# EAGLE schematic 6502_nes_book (EAGLE 6.4), part 4 of 5
## Sheet 20 of 29
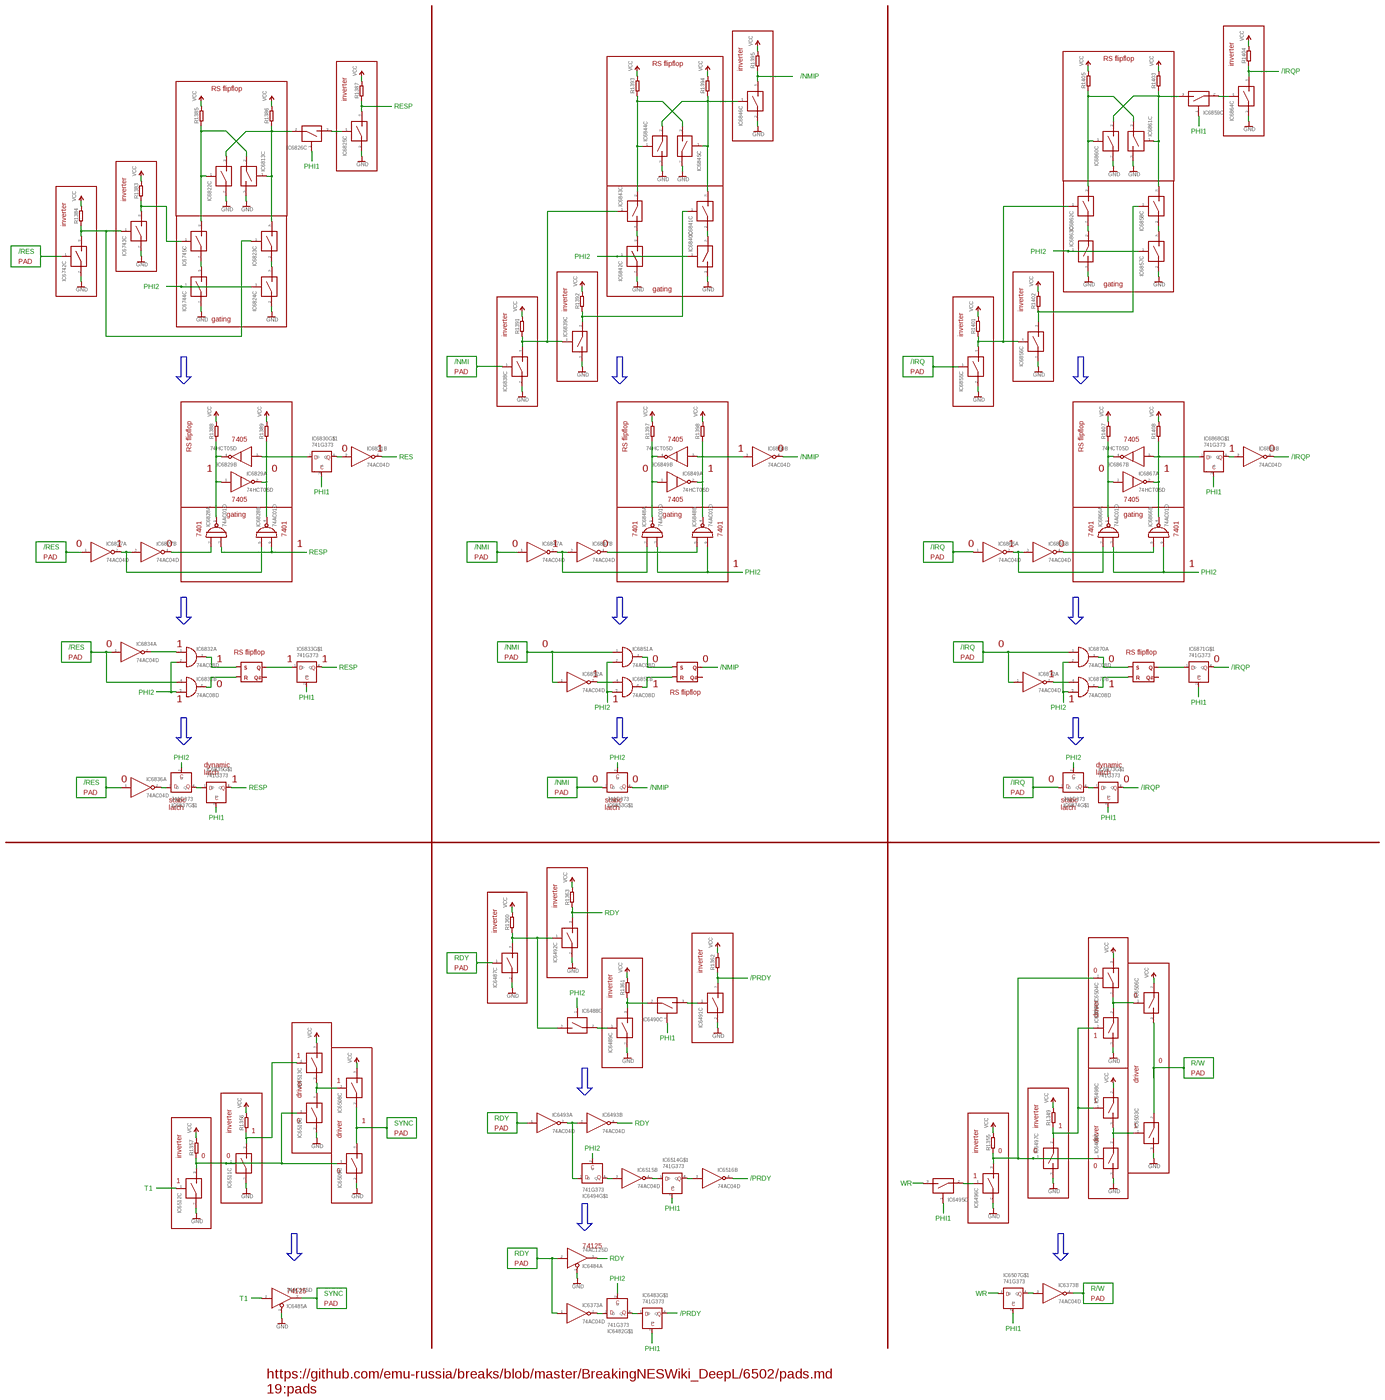
[diagram p24: schematic, sheet 20, overview]
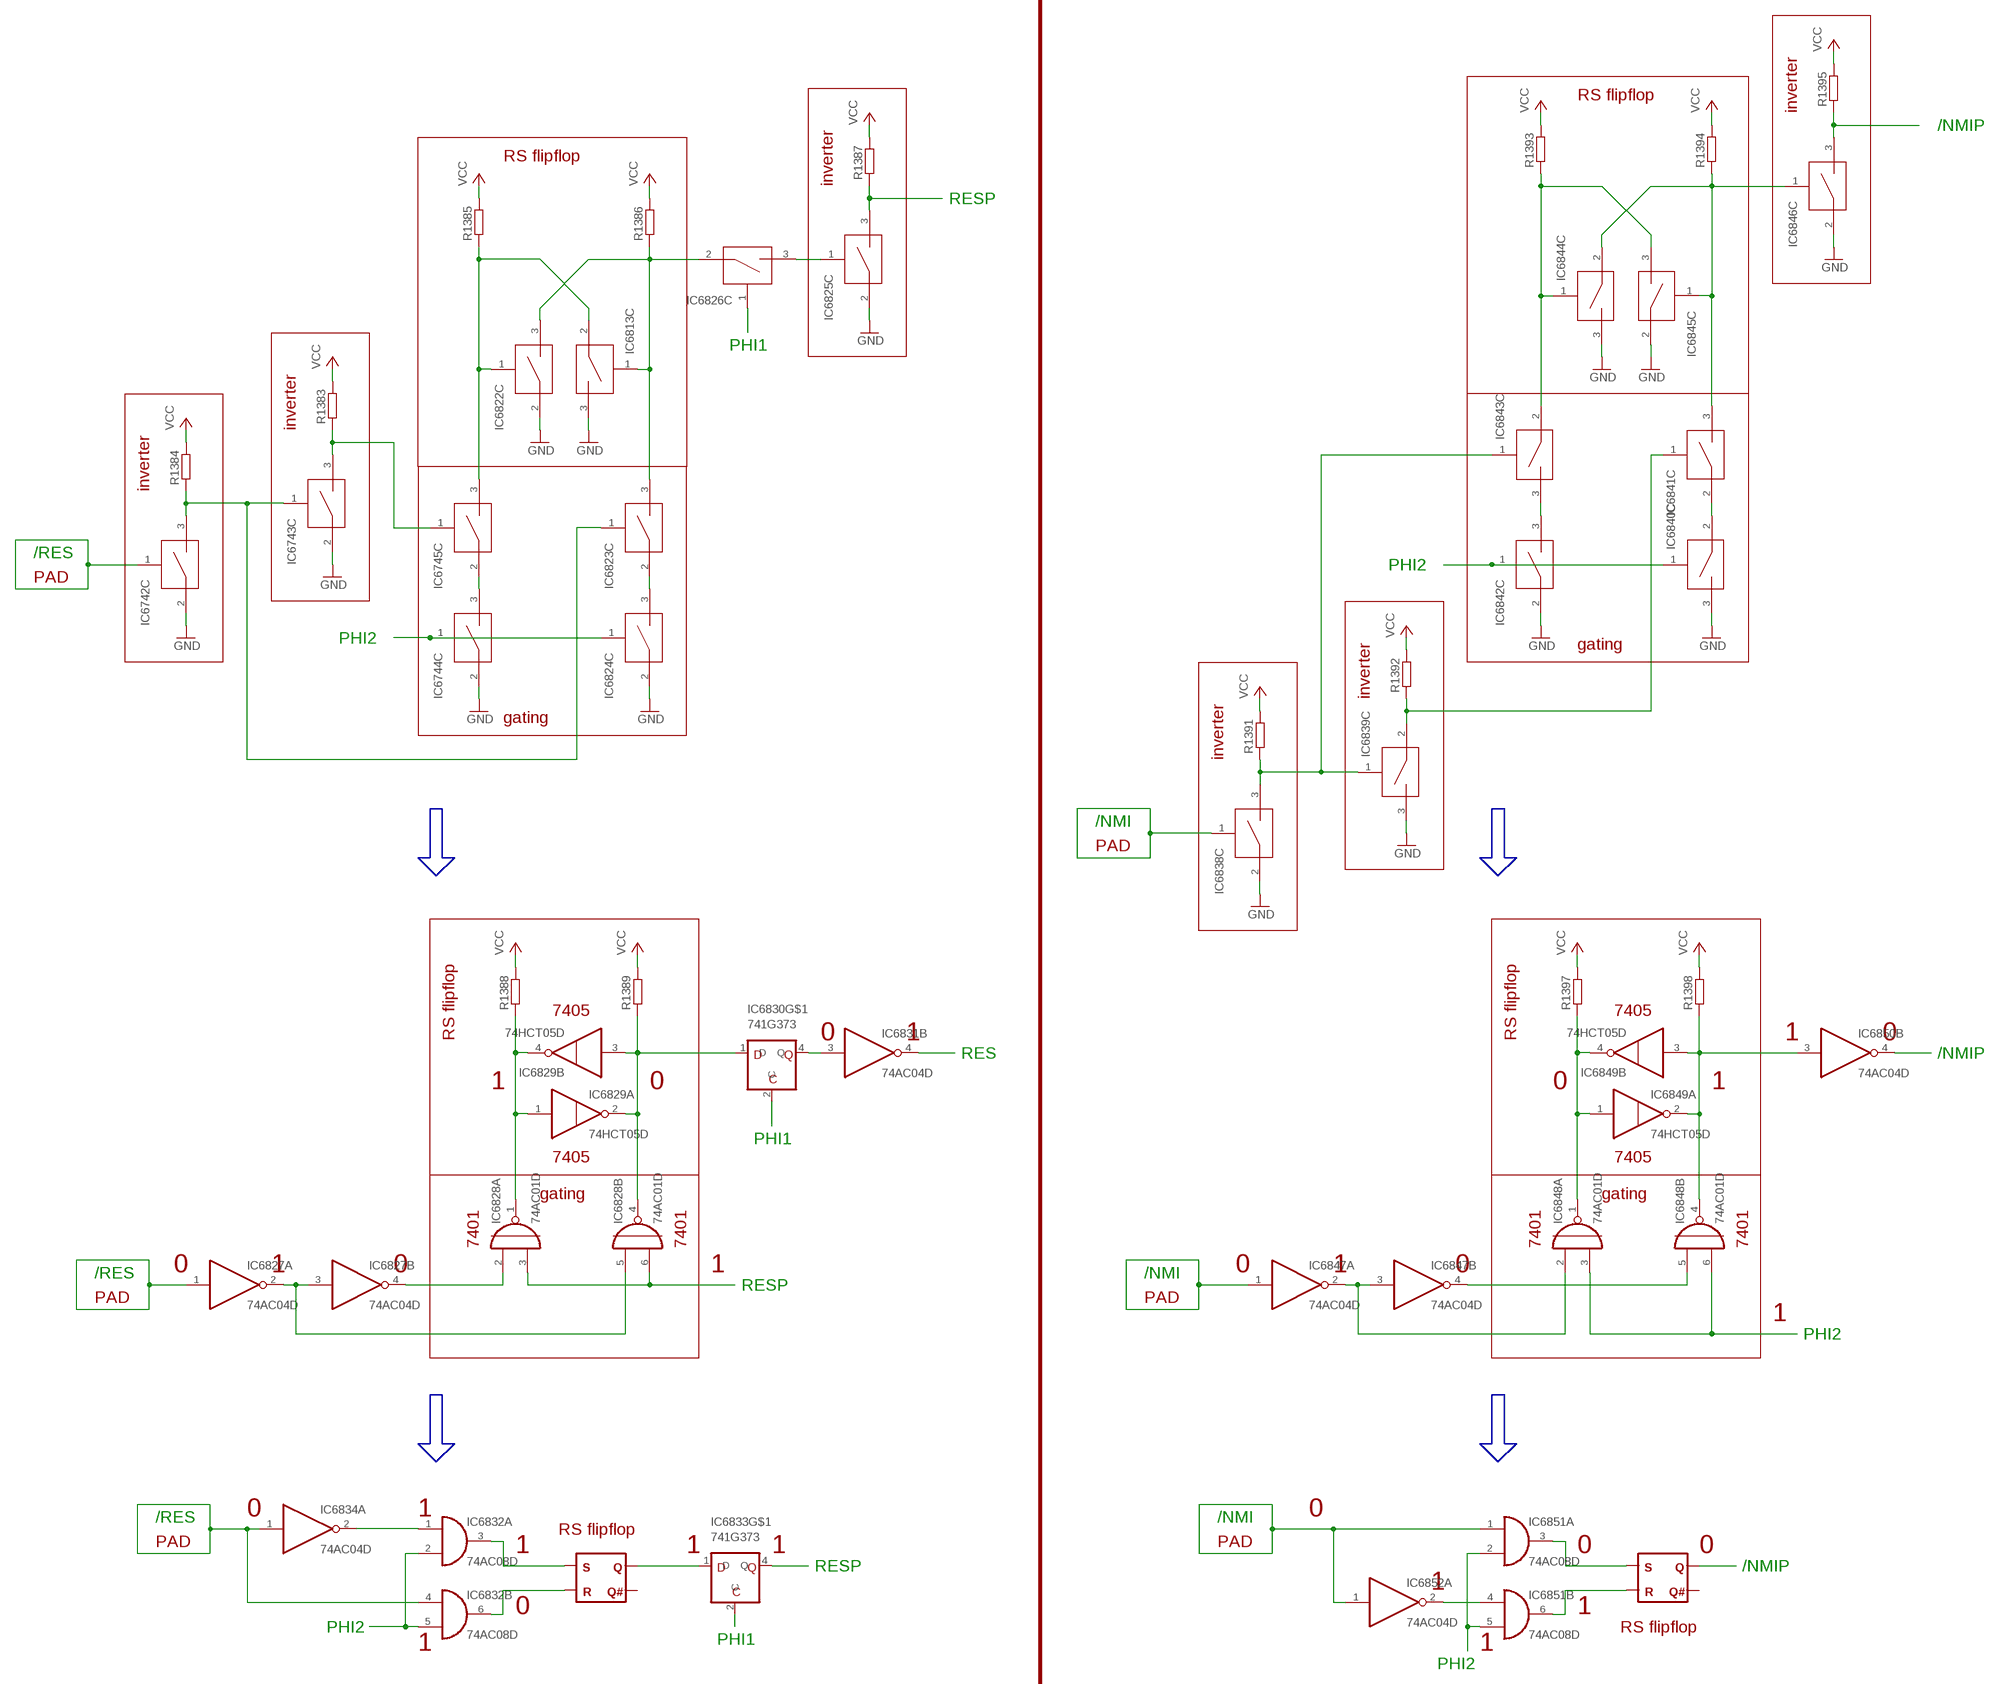
[diagram p25: schematic, sheet 20, part 1 of 4]
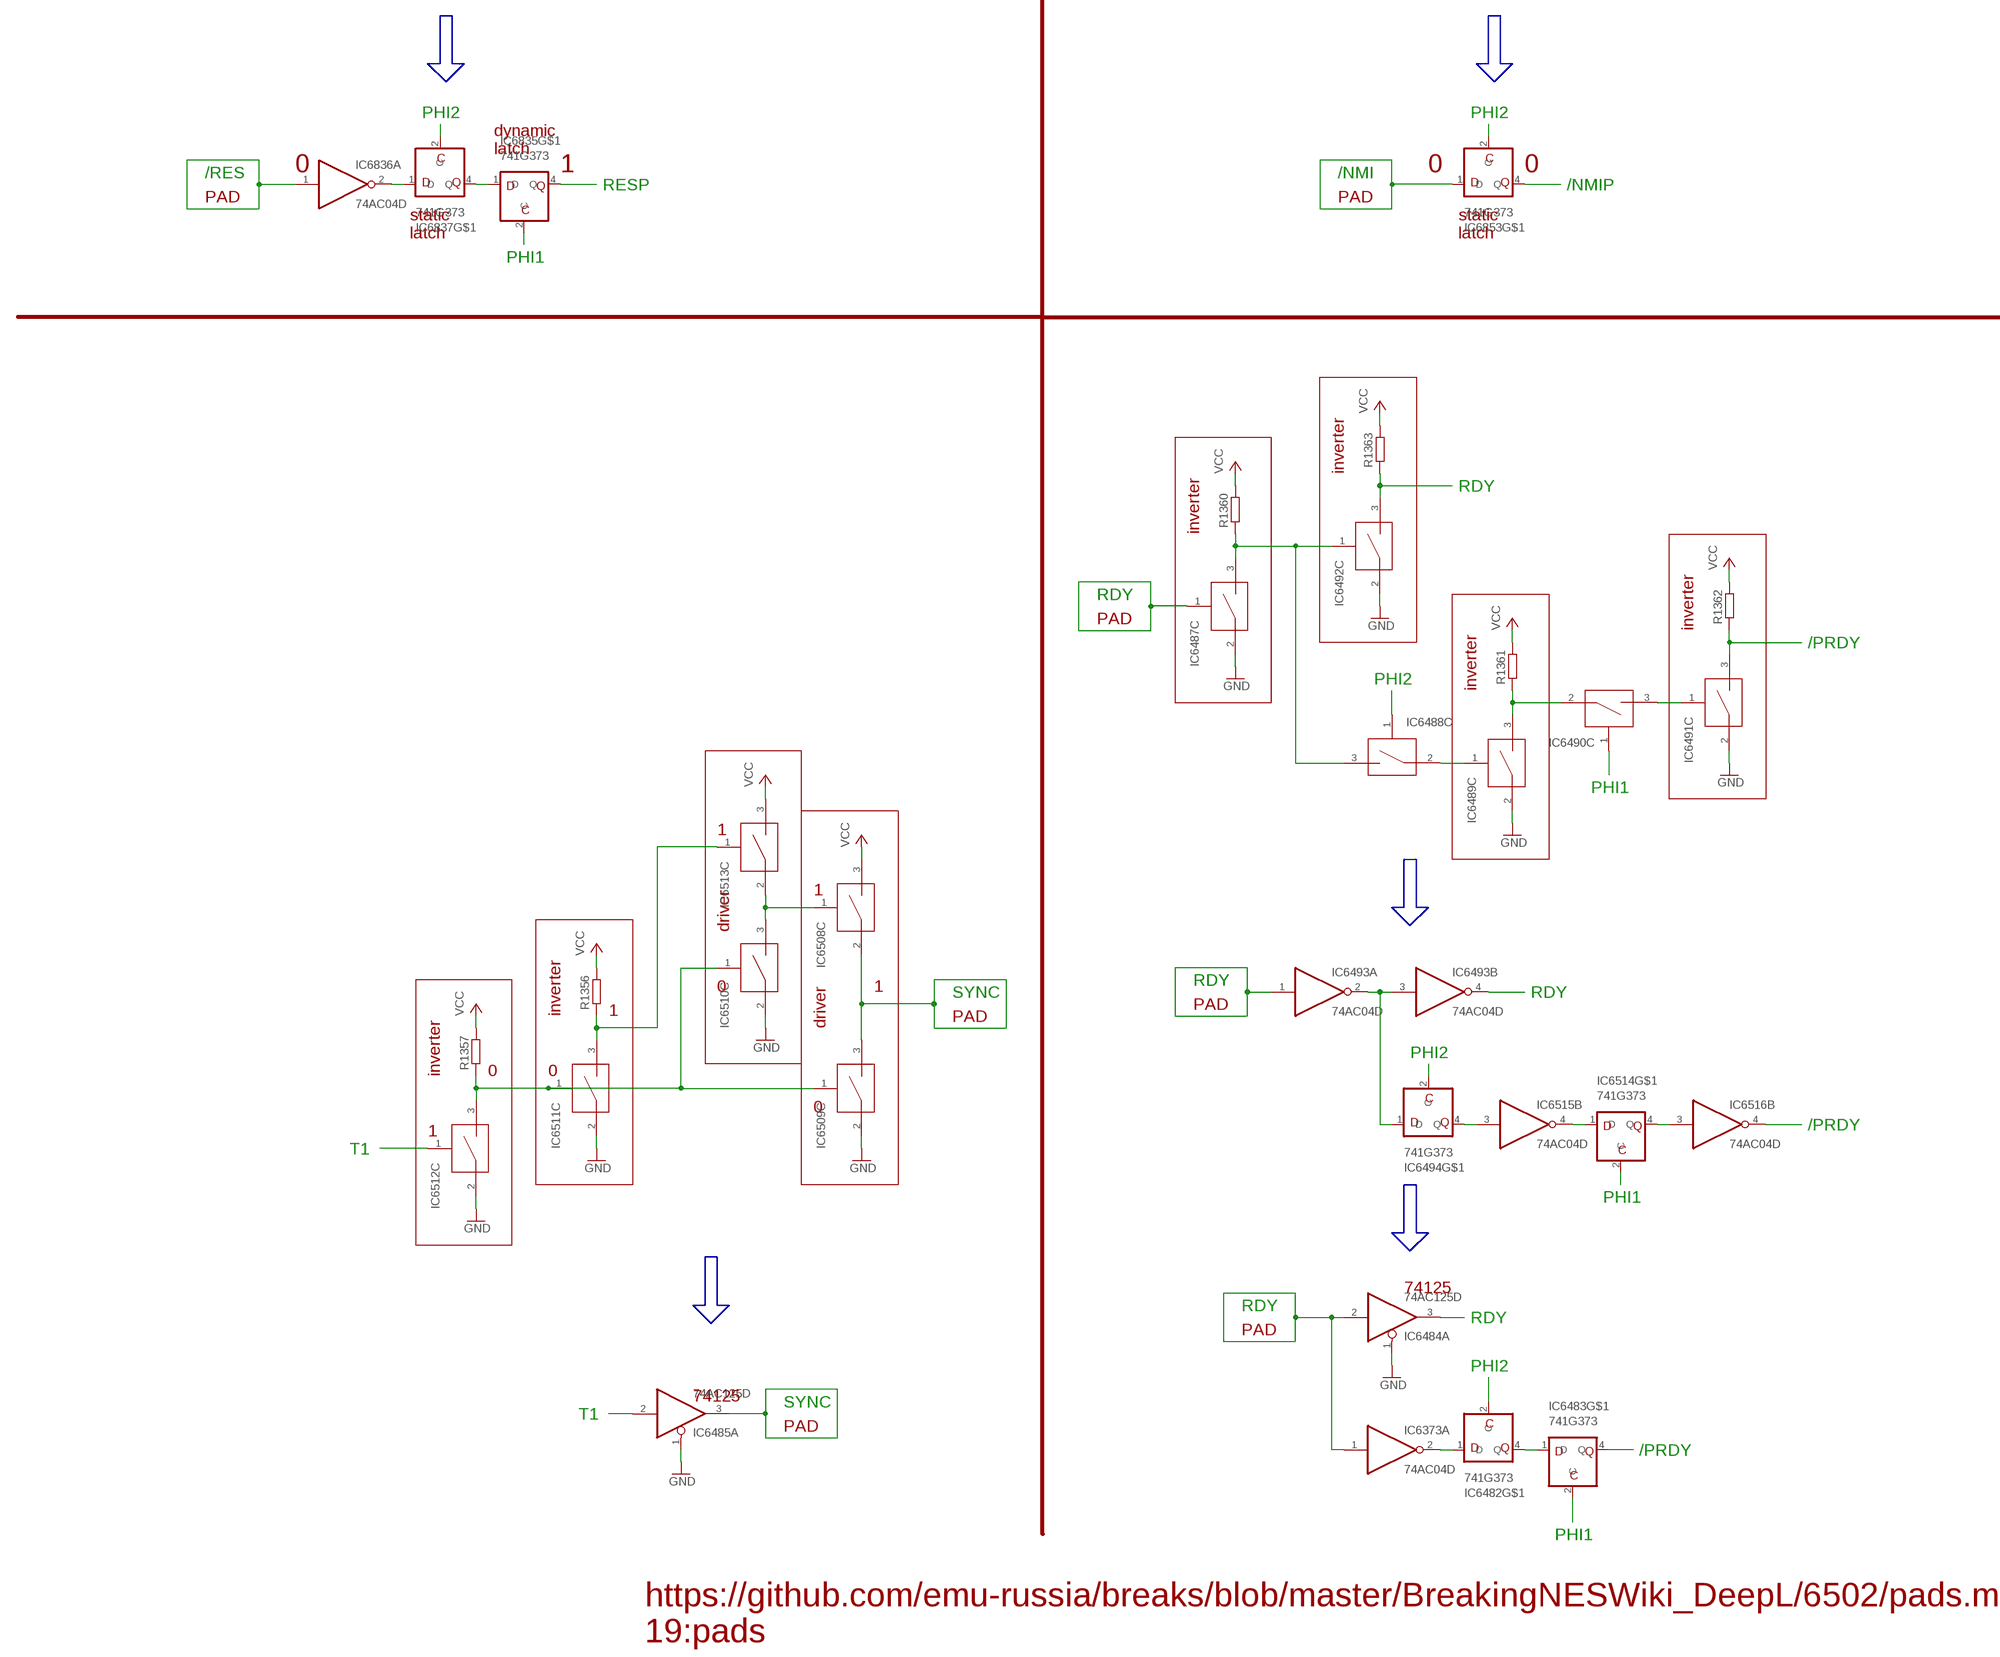
[diagram p26: schematic, sheet 20, part 2 of 4]
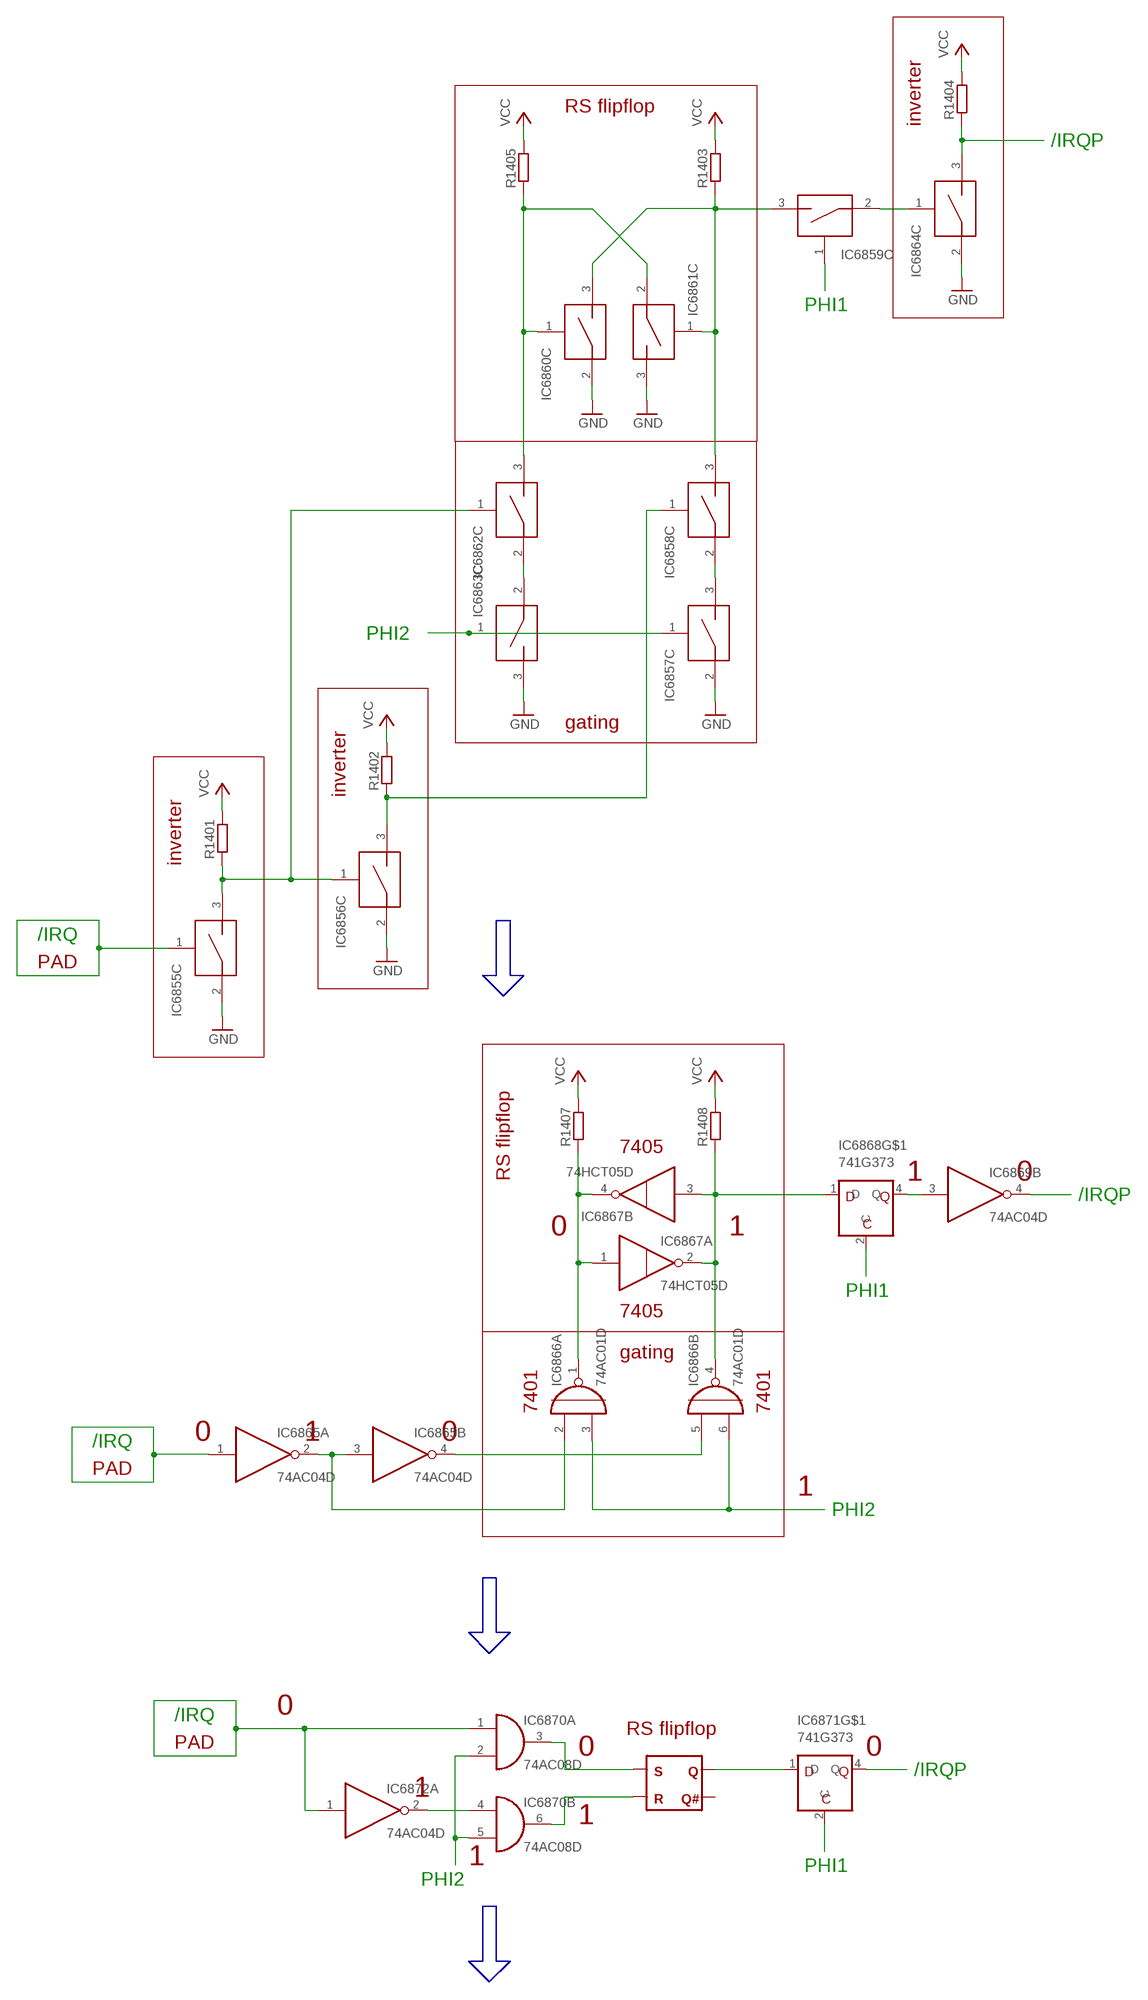
[diagram p27: schematic, sheet 20, part 3 of 4]
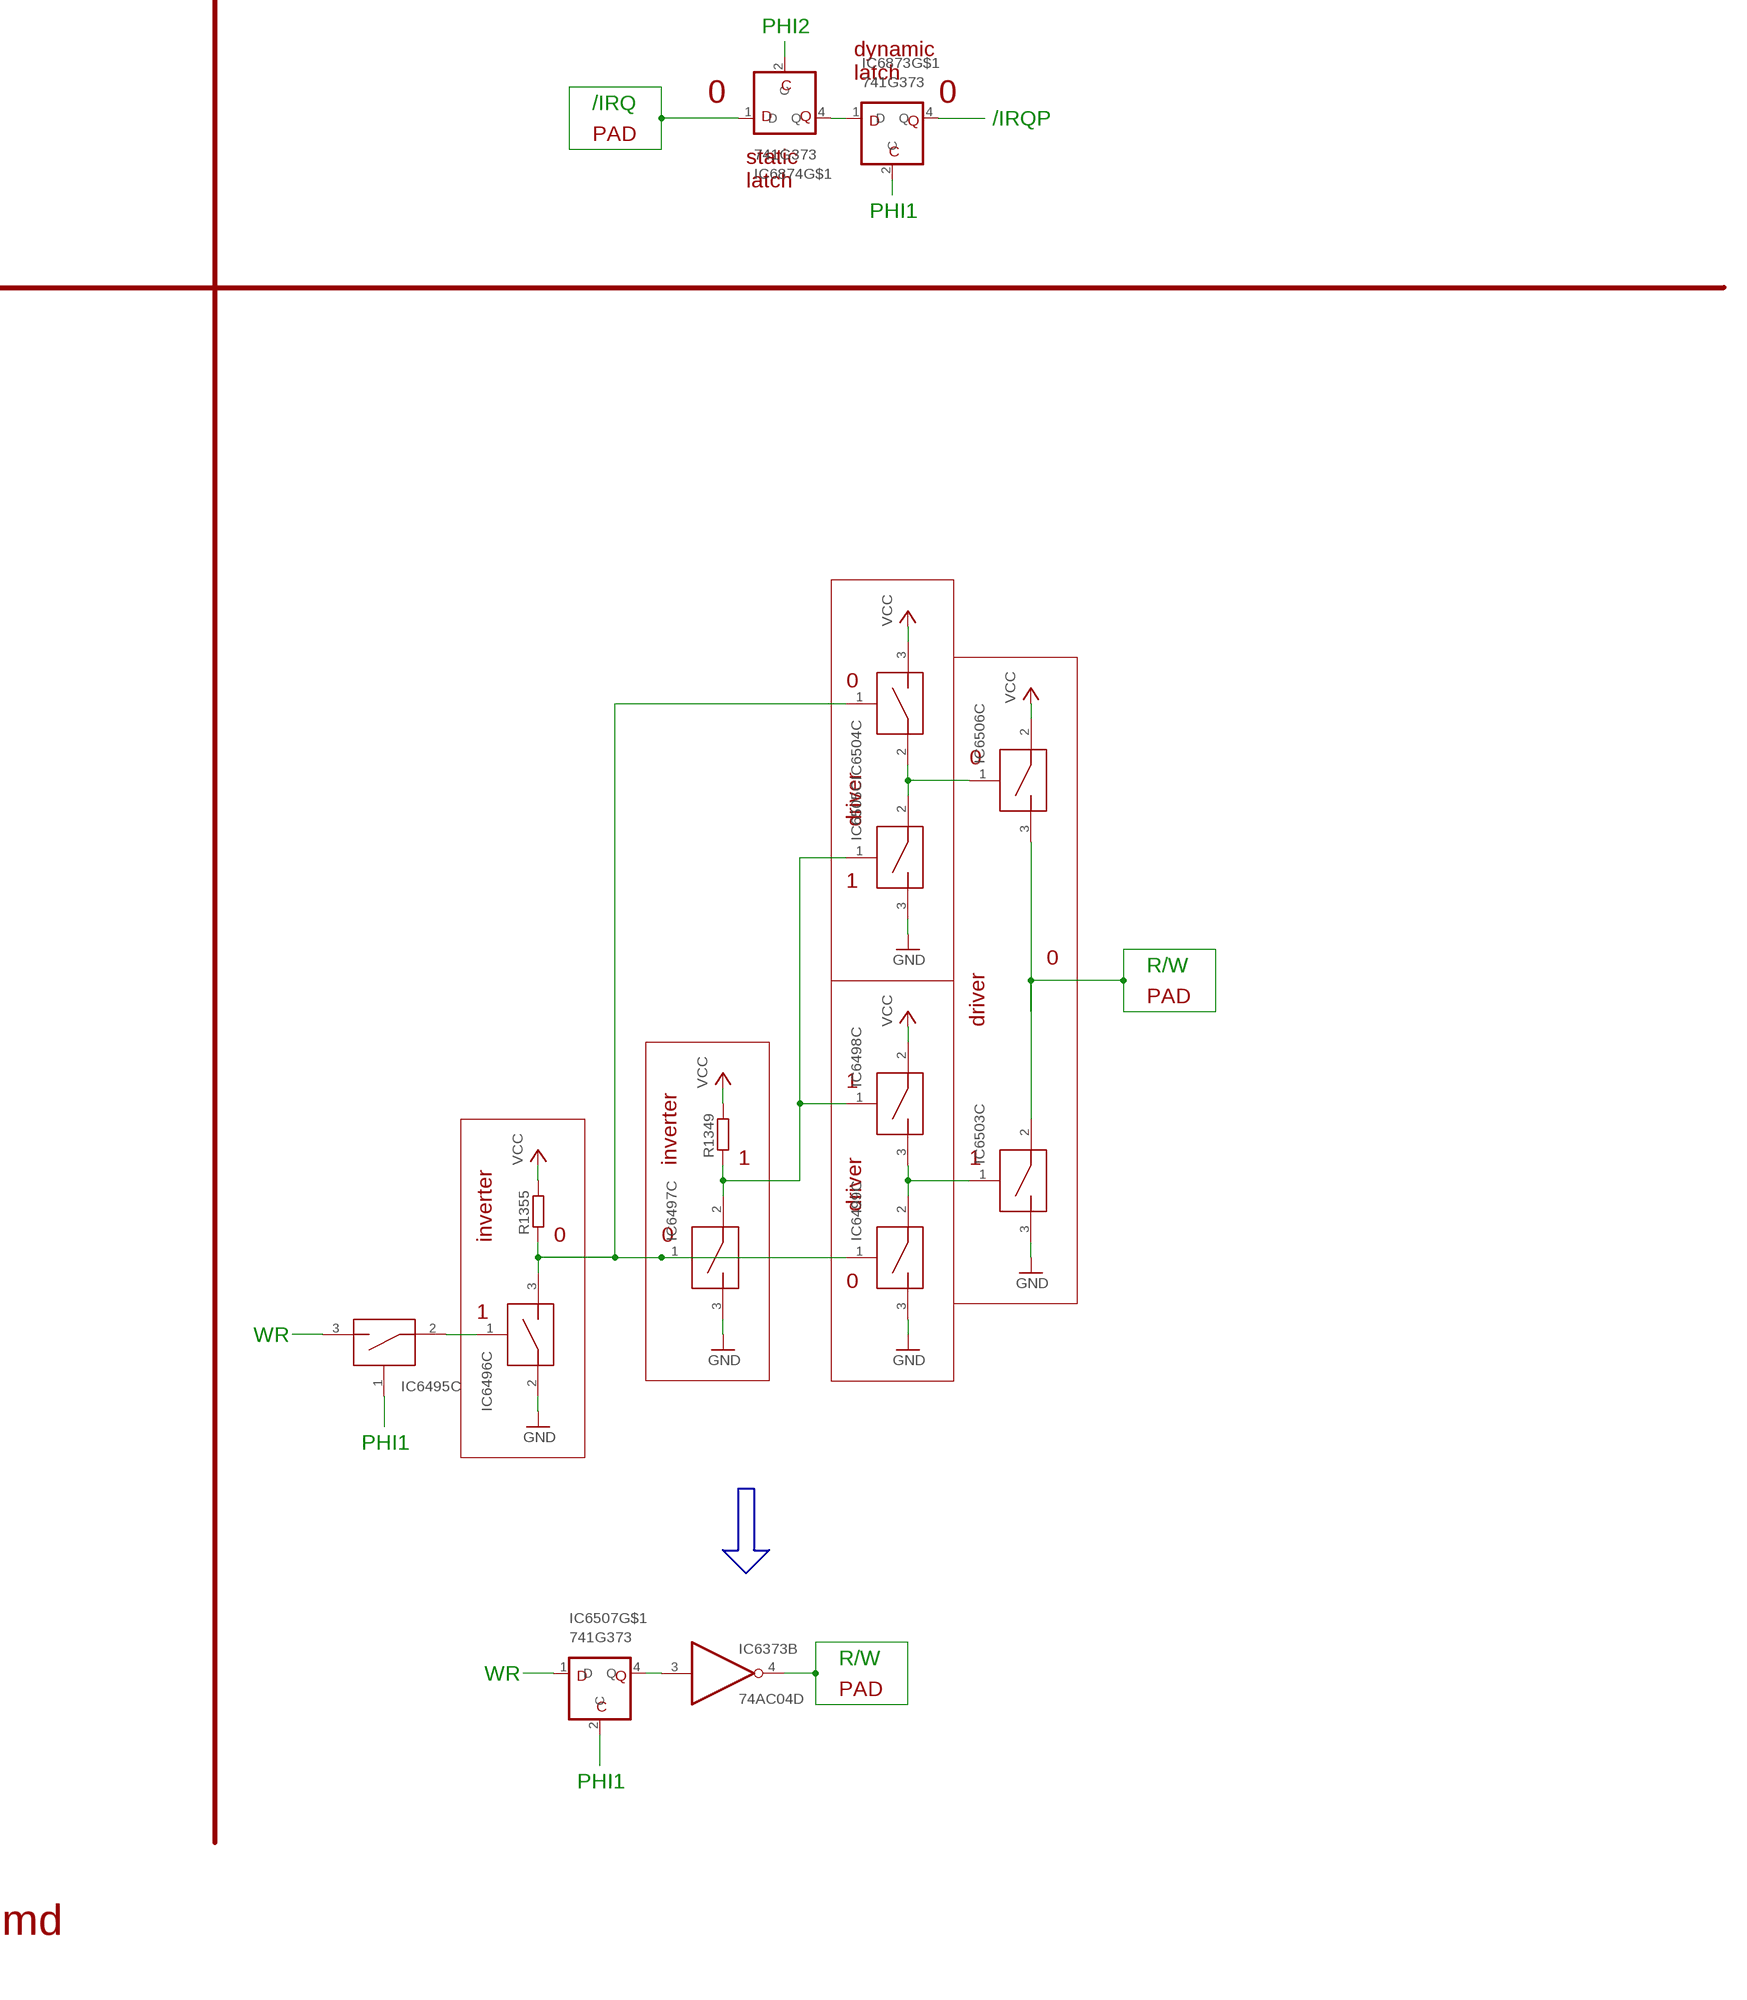
[diagram p28: schematic, sheet 20, part 4 of 4]

### Parts
IC6373  74AC04D  [SO14]
IC6482  741G373  [DBV-R-PDSO-G5]
IC6483  741G373  [DBV-R-PDSO-G5]
IC6484  74AC125D  [SO14]
IC6485  74AC125D  [SO14]
IC6487  MAX4613SO16  [SO16]
IC6488  MAX4613SO16  [SO16]
IC6489  MAX4613SO16  [SO16]
IC6490  MAX4613SO16  [SO16]
IC6491  MAX4613SO16  [SO16]
IC6492  MAX4613SO16  [SO16]
IC6493  74AC04D  [SO14]
IC6494  741G373  [DBV-R-PDSO-G5]
IC6495  MAX4613SO16  [SO16]
IC6496  MAX4613SO16  [SO16]
IC6497  MAX4613SO16  [SO16]
IC6498  MAX4613SO16  [SO16]
IC6499  MAX4613SO16  [SO16]
IC6503  MAX4613SO16  [SO16]
IC6504  MAX4613SO16  [SO16]
IC6505  MAX4613SO16  [SO16]
IC6506  MAX4613SO16  [SO16]
IC6507  741G373  [DBV-R-PDSO-G5]
IC6508  MAX4613SO16  [SO16]
IC6509  MAX4613SO16  [SO16]
IC6510  MAX4613SO16  [SO16]
IC6511  MAX4613SO16  [SO16]
IC6512  MAX4613SO16  [SO16]
IC6513  MAX4613SO16  [SO16]
IC6514  741G373  [DBV-R-PDSO-G5]
IC6515  74AC04D  [SO14]
IC6516  74AC04D  [SO14]
IC6742  MAX4613SO16  [SO16]
IC6743  MAX4613SO16  [SO16]
IC6744  MAX4613SO16  [SO16]
IC6745  MAX4613SO16  [SO16]
IC6813  MAX4613SO16  [SO16]
IC6822  MAX4613SO16  [SO16]
IC6823  MAX4613SO16  [SO16]
IC6824  MAX4613SO16  [SO16]
IC6825  MAX4613SO16  [SO16]
IC6826  MAX4613SO16  [SO16]
IC6827  74AC04D  [SO14]
IC6828  74AC01D  [SO14]
IC6829  74HCT05D  [SO14]
IC6830  741G373  [DBV-R-PDSO-G5]
IC6831  74AC04D  [SO14]
IC6832  74AC08D  [SO14]
IC6833  741G373  [DBV-R-PDSO-G5]
IC6834  74AC04D  [SO14]
IC6835  741G373  [DBV-R-PDSO-G5]
IC6836  74AC04D  [SO14]
IC6837  741G373  [DBV-R-PDSO-G5]
IC6838  MAX4613SO16  [SO16]
IC6839  MAX4613SO16  [SO16]
IC6840  MAX4613SO16  [SO16]
IC6841  MAX4613SO16  [SO16]
IC6842  MAX4613SO16  [SO16]
IC6843  MAX4613SO16  [SO16]
IC6844  MAX4613SO16  [SO16]
IC6845  MAX4613SO16  [SO16]
IC6846  MAX4613SO16  [SO16]
IC6847  74AC04D  [SO14]
IC6848  74AC01D  [SO14]
IC6849  74HCT05D  [SO14]
IC6850  74AC04D  [SO14]
IC6851  74AC08D  [SO14]
IC6852  74AC04D  [SO14]
IC6853  741G373  [DBV-R-PDSO-G5]
IC6855  MAX4613SO16  [SO16]
IC6856  MAX4613SO16  [SO16]
IC6857  MAX4613SO16  [SO16]
IC6858  MAX4613SO16  [SO16]
IC6859  MAX4613SO16  [SO16]
IC6860  MAX4613SO16  [SO16]
IC6861  MAX4613SO16  [SO16]
IC6862  MAX4613SO16  [SO16]
IC6863  MAX4613SO16  [SO16]
IC6864  MAX4613SO16  [SO16]
IC6865  74AC04D  [SO14]
IC6866  74AC01D  [SO14]
IC6867  74HCT05D  [SO14]
IC6868  741G373  [DBV-R-PDSO-G5]
IC6869  74AC04D  [SO14]
IC6870  74AC08D  [SO14]
IC6871  741G373  [DBV-R-PDSO-G5]
IC6872  74AC04D  [SO14]
IC6873  741G373  [DBV-R-PDSO-G5]
IC6874  741G373  [DBV-R-PDSO-G5]
R1349  R-EU_R0603  [R0603]
R1355  R-EU_R0603  [R0603]
R1356  R-EU_R0603  [R0603]
R1357  R-EU_R0603  [R0603]
R1360  R-EU_R0603  [R0603]
R1361  R-EU_R0603  [R0603]
R1362  R-EU_R0603  [R0603]
R1363  R-EU_R0603  [R0603]
R1383  R-EU_R0603  [R0603]
R1384  R-EU_R0603  [R0603]
R1385  R-EU_R0603  [R0603]
R1386  R-EU_R0603  [R0603]
R1387  R-EU_R0603  [R0603]
R1388  R-EU_R0603  [R0603]
R1389  R-EU_R0603  [R0603]
R1391  R-EU_R0603  [R0603]
R1392  R-EU_R0603  [R0603]
R1393  R-EU_R0603  [R0603]
R1394  R-EU_R0603  [R0603]
R1395  R-EU_R0603  [R0603]
R1397  R-EU_R0603  [R0603]
R1398  R-EU_R0603  [R0603]
R1401  R-EU_R0603  [R0603]
R1402  R-EU_R0603  [R0603]
R1403  R-EU_R0603  [R0603]
R1404  R-EU_R0603  [R0603]
R1405  R-EU_R0603  [R0603]
R1407  R-EU_R0603  [R0603]
R1408  R-EU_R0603  [R0603]

### Nets
GND: IC6484.1(A:OE) IC6485.1(A:OE) IC6487.2 IC6489.2 IC6491.2 IC6492.2 IC6496.2 IC6497.3 IC6499.3 IC6503.3 IC6505.3 IC6509.2 IC6510.2 IC6511.2 IC6512.2 IC6742.2 IC6743.2 IC6744.2 IC6813.3 IC6822.2 IC6824.2 IC6825.2 IC6838.2 IC6839.3 IC6840.3 IC6842.2 IC6844.3 IC6845.2 IC6846.2 IC6855.2 IC6856.2 IC6857.2 IC6860.2 IC6861.3 IC6863.3 IC6864.2 ; also sheet 1,2,3,4,9,10,11,12,13,14,19,21,22,23
N$11620: IC6484.3(A:O)
N$11621: IC6373.1(A:I) IC6484.2(A:I)
N$11622: IC6482.2(C)
N$11623: IC6483.2(C)
N$11624: IC6373.2(A:O) IC6482.1(D)
N$11625: IC6482.4(Q) IC6483.1(D)
N$11626: IC6483.4(Q)
N$11627: IC6485.3(A:O)
N$11628: IC6485.2(A:I)
N$11707: IC6487.1
N$11710: IC6487.3 IC6488.3 IC6492.1 R1360.1
N$11754: IC6488.1
N$11755: IC6488.2 IC6489.1
N$11756: IC6489.3 IC6490.2 R1361.1
N$11757: IC6507.2(C)
N$11758: IC6497.2 IC6498.1 IC6505.1 R1349.1
N$11759: IC6495.3
N$11760: IC6495.1
N$11761: IC6496.3 IC6497.1 IC6499.1 IC6504.1 R1355.1
N$11763: IC6495.2 IC6496.1
N$11764: IC6504.2 IC6505.2 IC6506.1
N$11765: IC6503.2 IC6506.3
N$11766: IC6498.3 IC6499.2 IC6503.1
N$11767: IC6507.1(D)
N$11769: IC6373.3(B:I) IC6507.4(Q)
N$11770: IC6490.1
N$11771: IC6373.4(B:O)
N$11772: IC6508.2 IC6509.3
N$11773: IC6491.3 R1362.1
N$11774: IC6511.3 IC6513.1 R1356.1
N$11775: IC6509.1 IC6510.1 IC6511.1 IC6512.3 R1357.1
N$11776: IC6512.1
N$11777: IC6508.1 IC6510.3 IC6513.2
N$11778: IC6492.3 R1363.1
N$11779: IC6490.3 IC6491.1
N$11780: IC6493.1(A:I)
N$11781: IC6493.4(B:O)
N$11782: IC6494.2(C)
N$11783: IC6514.2(C)
N$11784: IC6493.2(A:O) IC6493.3(B:I) IC6494.1(D)
N$11786: IC6494.4(Q) IC6515.3(B:I)
N$11787: IC6514.1(D) IC6515.4(B:O)
N$11788: IC6514.4(Q) IC6516.3(B:I)
N$11938: IC6516.4(B:O)
N$12262: IC6744.1 IC6824.1
N$12263: IC6742.1
N$12264: IC6826.1
N$12265: IC6838.1
N$12266: IC6742.3 IC6743.1 IC6823.1 R1384.1
N$12267: IC6743.3 IC6745.1 R1383.1
N$12268: IC6813.1 IC6822.3 IC6823.3 IC6826.2 R1386.1
N$12269: IC6745.3 IC6813.2 IC6822.1 R1385.1
N$12270: IC6825.3 R1387.1
N$12271: IC6744.3 IC6745.2
N$12443: IC6823.2 IC6824.3
N$12445: IC6840.1 IC6842.1
N$12448: IC6825.1 IC6826.3
N$12503: IC6827.1(A:I)
N$12506: IC6827.2(A:O) IC6827.3(B:I) IC6828.5(B:I0)
N$12507: IC6827.4(B:O) IC6828.2(A:I0)
N$12508: IC6828.3(A:I1) IC6828.6(B:I1)
N$12509: IC6828.1(A:O) IC6829.1(A:I) IC6829.4(B:O) R1388.1
N$12510: IC6828.4(B:O) IC6829.2(A:O) IC6829.3(B:I) IC6830.1(D) R1389.1
N$12511: IC6830.2(C)
N$12512: IC6830.4(Q) IC6831.3(B:I)
N$12513: IC6831.4(B:O)
N$12514: IC6833.2(C)
N$12515: IC6833.4(Q)
N$12516: IC6833.1(D)
N$12538: IC6832.3(A:O)
N$12540: IC6832.6(B:O)
N$12541: IC6832.4(B:I0) IC6834.1(A:I)
N$12542: IC6832.2(A:I1) IC6832.5(B:I1)
N$12543: IC6832.1(A:I0) IC6834.2(A:O)
N$12544: IC6835.2(C)
N$12545: IC6835.4(Q)
N$12546: IC6836.1(A:I)
N$12547: IC6837.2(C)
N$12548: IC6835.1(D) IC6837.4(Q)
N$12549: IC6836.2(A:O) IC6837.1(D)
N$12550: IC6838.3 IC6839.1 IC6843.1 R1391.1
N$12551: IC6839.2 IC6841.1 R1392.1
N$12552: IC6857.1 IC6863.1
N$12553: IC6840.2 IC6841.2
N$12554: IC6842.3 IC6843.3
N$12555: IC6843.2 IC6844.1 IC6845.3 R1393.1
N$12556: IC6841.3 IC6844.2 IC6845.1 IC6846.1 R1394.1
N$12557: IC6846.3 R1395.1
N$12559: IC6847.1(A:I)
N$12560: IC6847.2(A:O) IC6847.3(B:I) IC6848.2(A:I0)
N$12561: IC6848.3(A:I1) IC6848.6(B:I1)
N$12562: IC6848.1(A:O) IC6849.1(A:I) IC6849.4(B:O) R1397.1
N$12563: IC6848.4(B:O) IC6849.2(A:O) IC6849.3(B:I) IC6850.3(B:I) R1398.1
N$12564: IC6850.4(B:O)
N$12566: IC6851.3(A:O)
N$12567: IC6851.6(B:O)
N$12568: IC6851.1(A:I0) IC6852.1(A:I)
N$12569: IC6851.2(A:I1) IC6851.5(B:I1)
N$12570: IC6853.4(Q)
N$12571: IC6853.1(D)
N$12572: IC6853.2(C)
N$12573: IC6847.4(B:O) IC6848.5(B:I0)
N$12574: IC6851.4(B:I0) IC6852.2(A:O)
N$12575: IC6855.1
N$12577: IC6855.3 IC6856.1 IC6862.1 R1401.1
N$12578: IC6856.3 IC6858.1 R1402.1
N$12579: IC6858.3 IC6859.3 IC6860.3 IC6861.1 R1403.1
N$12580: IC6859.2 IC6864.1
N$12581: IC6864.3 R1404.1
N$12582: IC6862.2 IC6863.2
N$12583: IC6860.1 IC6861.2 IC6862.3 R1405.1
N$12584: IC6859.1
N$12586: IC6857.3 IC6858.2
N$12587: IC6865.1(A:I)
N$12589: IC6865.2(A:O) IC6865.3(B:I) IC6866.2(A:I0)
N$12590: IC6866.3(A:I1) IC6866.6(B:I1)
N$12591: IC6866.1(A:O) IC6867.1(A:I) IC6867.4(B:O) R1407.1
N$12592: IC6866.4(B:O) IC6867.2(A:O) IC6867.3(B:I) IC6868.1(D) R1408.1
N$12593: IC6868.2(C)
N$12594: IC6868.4(Q) IC6869.3(B:I)
N$12595: IC6869.4(B:O)
N$12596: IC6871.2(C)
N$12597: IC6871.4(Q)
N$12598: IC6871.1(D)
N$12599: IC6870.3(A:O)
N$12600: IC6870.6(B:O)
N$12601: IC6870.1(A:I0) IC6872.1(A:I)
N$12602: IC6870.2(A:I1) IC6870.5(B:I1)
N$12603: IC6873.2(C)
N$12604: IC6873.4(Q)
N$12605: IC6874.1(D)
N$12606: IC6874.2(C)
N$12607: IC6873.1(D) IC6874.4(Q)
N$12608: IC6865.4(B:O) IC6866.5(B:I0)
N$12609: IC6870.4(B:I0) IC6872.2(A:O)
VCC: IC6498.2 IC6504.3 IC6506.2 IC6508.3 IC6513.3 R1349.2 R1355.2 R1356.2 R1357.2 R1360.2 R1361.2 R1362.2 R1363.2 R1383.2 R1384.2 R1385.2 R1386.2 R1387.2 R1388.2 R1389.2 R1391.2 R1392.2 R1393.2 R1394.2 R1395.2 R1397.2 R1398.2 R1401.2 R1402.2 R1403.2 R1404.2 R1405.2 R1407.2 R1408.2 ; also sheet 1,2,3,4,9,11,12,13,19,21,22,23,26
Unconnected: IC6373.5(C:I) IC6373.6(C:O) IC6373.8(D:O) IC6373.9(D:I) IC6373.10(E:O) IC6373.11(E:I) IC6373.12(F:O) IC6373.13(F:I) IC6484.4(B:OE) IC6484.5(B:I) IC6484.6(B:O) IC6484.8(C:O) IC6484.9(C:I) IC6484.10(C:OE) IC6484.11(D:O) IC6484.12(D:I) IC6484.13(D:OE) IC6485.4(B:OE) IC6485.5(B:I) IC6485.6(B:O) IC6485.8(C:O) IC6485.9(C:I) IC6485.10(C:OE) IC6485.11(D:O) IC6485.12(D:I) IC6485.13(D:OE) IC6487.4(PWR:V-) IC6487.5(PWR:GND) IC6487.6 IC6487.7 IC6487.8 IC6487.9 IC6487.10 IC6487.11 IC6487.12(PWR:VCC) IC6487.13(PWR:V+) IC6487.14 IC6487.15 IC6487.16 IC6488.4(PWR:V-) IC6488.5(PWR:GND) IC6488.6 IC6488.7 IC6488.8 IC6488.9 IC6488.10 IC6488.11 IC6488.12(PWR:VCC) IC6488.13(PWR:V+) IC6488.14 IC6488.15 IC6488.16 IC6489.4(PWR:V-) IC6489.5(PWR:GND) IC6489.6 IC6489.7 IC6489.8 IC6489.9 IC6489.10 IC6489.11 IC6489.12(PWR:VCC) IC6489.13(PWR:V+) IC6489.14 IC6489.15 IC6489.16 IC6490.4(PWR:V-) IC6490.5(PWR:GND) IC6490.6 IC6490.7 IC6490.8 IC6490.9 IC6490.10 IC6490.11 IC6490.12(PWR:VCC) IC6490.13(PWR:V+) IC6490.14 IC6490.15 IC6490.16 IC6491.4(PWR:V-) IC6491.5(PWR:GND) IC6491.6 IC6491.7 IC6491.8 IC6491.9 IC6491.10 IC6491.11 IC6491.12(PWR:VCC) IC6491.13(PWR:V+) IC6491.14 IC6491.15 IC6491.16 IC6492.4(PWR:V-) IC6492.5(PWR:GND) IC6492.6 IC6492.7 IC6492.8 IC6492.9 IC6492.10 IC6492.11 IC6492.12(PWR:VCC) IC6492.13(PWR:V+) IC6492.14 IC6492.15 IC6492.16 IC6493.5(C:I) IC6493.6(C:O) IC6493.8(D:O) IC6493.9(D:I) IC6493.10(E:O) IC6493.11(E:I) IC6493.12(F:O) IC6493.13(F:I) IC6495.4(PWR:V-) IC6495.5(PWR:GND) IC6495.6 IC6495.7 IC6495.8 IC6495.9 IC6495.10 IC6495.11 IC6495.12(PWR:VCC) IC6495.13(PWR:V+) IC6495.14 IC6495.15 IC6495.16 IC6496.4(PWR:V-) IC6496.5(PWR:GND) IC6496.6 IC6496.7 IC6496.8 IC6496.9 IC6496.10 IC6496.11 IC6496.12(PWR:VCC) IC6496.13(PWR:V+) IC6496.14 IC6496.15 IC6496.16 IC6497.4(PWR:V-) IC6497.5(PWR:GND) IC6497.6 IC6497.7 IC6497.8 IC6497.9 IC6497.10 IC6497.11 IC6497.12(PWR:VCC) IC6497.13(PWR:V+) IC6497.14 IC6497.15 IC6497.16 IC6498.4(PWR:V-) IC6498.5(PWR:GND) IC6498.6 IC6498.7 IC6498.8 IC6498.9 IC6498.10 IC6498.11 IC6498.12(PWR:VCC) IC6498.13(PWR:V+) IC6498.14 IC6498.15 IC6498.16 IC6499.4(PWR:V-) IC6499.5(PWR:GND) IC6499.6 IC6499.7 IC6499.8 IC6499.9 IC6499.10 IC6499.11 IC6499.12(PWR:VCC) IC6499.13(PWR:V+) IC6499.14 IC6499.15 IC6499.16 IC6503.4(PWR:V-) IC6503.5(PWR:GND) IC6503.6 IC6503.7 IC6503.8 IC6503.9 IC6503.10 IC6503.11 IC6503.12(PWR:VCC) IC6503.13(PWR:V+) IC6503.14 IC6503.15 IC6503.16 IC6504.4(PWR:V-) IC6504.5(PWR:GND) IC6504.6 IC6504.7 IC6504.8 IC6504.9 IC6504.10 IC6504.11 IC6504.12(PWR:VCC) IC6504.13(PWR:V+) IC6504.14 IC6504.15 IC6504.16 IC6505.4(PWR:V-) IC6505.5(PWR:GND) IC6505.6 IC6505.7 IC6505.8 IC6505.9 IC6505.10 IC6505.11 IC6505.12(PWR:VCC) IC6505.13(PWR:V+) IC6505.14 IC6505.15 IC6505.16 IC6506.4(PWR:V-) IC6506.5(PWR:GND) IC6506.6 IC6506.7 IC6506.8 IC6506.9 IC6506.10 IC6506.11 IC6506.12(PWR:VCC) IC6506.13(PWR:V+) IC6506.14 IC6506.15 IC6506.16 IC6508.4(PWR:V-) IC6508.5(PWR:GND) IC6508.6 IC6508.7 IC6508.8 IC6508.9 IC6508.10 IC6508.11 IC6508.12(PWR:VCC) IC6508.13(PWR:V+) IC6508.14 IC6508.15 IC6508.16 IC6509.4(PWR:V-) IC6509.5(PWR:GND) IC6509.6 IC6509.7 IC6509.8 IC6509.9 IC6509.10 IC6509.11 IC6509.12(PWR:VCC) IC6509.13(PWR:V+) IC6509.14 IC6509.15 IC6509.16 IC6510.4(PWR:V-) IC6510.5(PWR:GND) IC6510.6 IC6510.7 IC6510.8 IC6510.9 IC6510.10 IC6510.11 IC6510.12(PWR:VCC) IC6510.13(PWR:V+) IC6510.14 IC6510.15 IC6510.16 IC6511.4(PWR:V-) IC6511.5(PWR:GND) IC6511.6 IC6511.7 IC6511.8 IC6511.9 IC6511.10 IC6511.11 IC6511.12(PWR:VCC) IC6511.13(PWR:V+) IC6511.14 IC6511.15 IC6511.16 IC6512.4(PWR:V-) IC6512.5(PWR:GND) IC6512.6 IC6512.7 IC6512.8 IC6512.9 IC6512.10 IC6512.11 IC6512.12(PWR:VCC) IC6512.13(PWR:V+) IC6512.14 IC6512.15 IC6512.16 IC6513.4(PWR:V-) IC6513.5(PWR:GND) IC6513.6 IC6513.7 IC6513.8 IC6513.9 IC6513.10 IC6513.11 IC6513.12(PWR:VCC) IC6513.13(PWR:V+) IC6513.14 IC6513.15 IC6513.16 IC6515.1(A:I) IC6515.2(A:O) IC6515.5(C:I) IC6515.6(C:O) IC6515.8(D:O) IC6515.9(D:I) IC6515.10(E:O) IC6515.11(E:I) IC6515.12(F:O) IC6515.13(F:I) IC6516.1(A:I) IC6516.2(A:O) IC6516.5(C:I) IC6516.6(C:O) IC6516.8(D:O) IC6516.9(D:I) IC6516.10(E:O) IC6516.11(E:I) IC6516.12(F:O) IC6516.13(F:I) IC6742.4(PWR:V-) IC6742.5(PWR:GND) IC6742.6 IC6742.7 IC6742.8 IC6742.9 IC6742.10 IC6742.11 IC6742.12(PWR:VCC) IC6742.13(PWR:V+) IC6742.14 IC6742.15 IC6742.16 IC6743.4(PWR:V-) IC6743.5(PWR:GND) IC6743.6 IC6743.7 IC6743.8 IC6743.9 IC6743.10 IC6743.11 IC6743.12(PWR:VCC) IC6743.13(PWR:V+) IC6743.14 IC6743.15 IC6743.16 IC6744.4(PWR:V-) IC6744.5(PWR:GND) IC6744.6 IC6744.7 IC6744.8 IC6744.9 IC6744.10 IC6744.11 IC6744.12(PWR:VCC) IC6744.13(PWR:V+) IC6744.14 IC6744.15 IC6744.16 IC6745.4(PWR:V-) IC6745.5(PWR:GND) IC6745.6 IC6745.7 IC6745.8 IC6745.9 IC6745.10 IC6745.11 IC6745.12(PWR:VCC) IC6745.13(PWR:V+) IC6745.14 IC6745.15 IC6745.16 IC6813.4(PWR:V-) IC6813.5(PWR:GND) IC6813.6 IC6813.7 IC6813.8 IC6813.9 IC6813.10 IC6813.11 IC6813.12(PWR:VCC) IC6813.13(PWR:V+) IC6813.14 IC6813.15 IC6813.16 IC6822.4(PWR:V-) IC6822.5(PWR:GND) IC6822.6 IC6822.7 IC6822.8 IC6822.9 IC6822.10 IC6822.11 IC6822.12(PWR:VCC) IC6822.13(PWR:V+) IC6822.14 IC6822.15 IC6822.16 IC6823.4(PWR:V-) IC6823.5(PWR:GND) IC6823.6 IC6823.7 IC6823.8 IC6823.9 IC6823.10 IC6823.11 IC6823.12(PWR:VCC) IC6823.13(PWR:V+) IC6823.14 IC6823.15 IC6823.16 IC6824.4(PWR:V-) IC6824.5(PWR:GND) IC6824.6 IC6824.7 IC6824.8 IC6824.9 IC6824.10 IC6824.11 IC6824.12(PWR:VCC) IC6824.13(PWR:V+) IC6824.14 IC6824.15 IC6824.16 IC6825.4(PWR:V-) IC6825.5(PWR:GND) IC6825.6 IC6825.7 IC6825.8 IC6825.9 IC6825.10 IC6825.11 IC6825.12(PWR:VCC) IC6825.13(PWR:V+) IC6825.14 IC6825.15 IC6825.16 IC6826.4(PWR:V-) IC6826.5(PWR:GND) IC6826.6 IC6826.7 IC6826.8 IC6826.9 IC6826.10 IC6826.11 IC6826.12(PWR:VCC) IC6826.13(PWR:V+) IC6826.14 IC6826.15 IC6826.16 IC6827.5(C:I) IC6827.6(C:O) IC6827.8(D:O) IC6827.9(D:I) IC6827.10(E:O) IC6827.11(E:I) IC6827.12(F:O) IC6827.13(F:I) IC6828.8(C:I0) IC6828.9(C:I1) IC6828.10(C:O) IC6828.11(D:I0) IC6828.12(D:I1) IC6828.13(D:O) IC6829.5(C:I) IC6829.6(C:O) IC6829.8(D:O) IC6829.9(D:I) IC6829.10(E:O) IC6829.11(E:I) IC6829.12(F:O) IC6829.13(F:I) IC6831.1(A:I) IC6831.2(A:O) IC6831.5(C:I) IC6831.6(C:O) IC6831.8(D:O) IC6831.9(D:I) IC6831.10(E:O) IC6831.11(E:I) IC6831.12(F:O) IC6831.13(F:I) IC6832.8(C:O) IC6832.9(C:I0) IC6832.10(C:I1) IC6832.11(D:O) IC6832.12(D:I0) IC6832.13(D:I1) IC6834.3(B:I) IC6834.4(B:O) IC6834.5(C:I) IC6834.6(C:O) IC6834.8(D:O) IC6834.9(D:I) IC6834.10(E:O) IC6834.11(E:I) IC6834.12(F:O) IC6834.13(F:I) IC6836.3(B:I) IC6836.4(B:O) IC6836.5(C:I) IC6836.6(C:O) IC6836.8(D:O) IC6836.9(D:I) IC6836.10(E:O) IC6836.11(E:I) IC6836.12(F:O) IC6836.13(F:I) IC6838.4(PWR:V-) IC6838.5(PWR:GND) IC6838.6 IC6838.7 IC6838.8 IC6838.9 IC6838.10 IC6838.11 IC6838.12(PWR:VCC) IC6838.13(PWR:V+) IC6838.14 IC6838.15 IC6838.16 IC6839.4(PWR:V-) IC6839.5(PWR:GND) IC6839.6 IC6839.7 IC6839.8 IC6839.9 IC6839.10 IC6839.11 IC6839.12(PWR:VCC) IC6839.13(PWR:V+) IC6839.14 IC6839.15 IC6839.16 IC6840.4(PWR:V-) IC6840.5(PWR:GND) IC6840.6 IC6840.7 IC6840.8 IC6840.9 IC6840.10 IC6840.11 IC6840.12(PWR:VCC) IC6840.13(PWR:V+) IC6840.14 IC6840.15 IC6840.16 IC6841.4(PWR:V-) IC6841.5(PWR:GND) IC6841.6 IC6841.7 IC6841.8 IC6841.9 IC6841.10 IC6841.11 IC6841.12(PWR:VCC) IC6841.13(PWR:V+) IC6841.14 IC6841.15 IC6841.16 IC6842.4(PWR:V-) IC6842.5(PWR:GND) IC6842.6 IC6842.7 IC6842.8 IC6842.9 IC6842.10 IC6842.11 IC6842.12(PWR:VCC) IC6842.13(PWR:V+) IC6842.14 IC6842.15 IC6842.16 IC6843.4(PWR:V-) IC6843.5(PWR:GND) IC6843.6 IC6843.7 IC6843.8 IC6843.9 IC6843.10 IC6843.11 IC6843.12(PWR:VCC) IC6843.13(PWR:V+) IC6843.14 IC6843.15 IC6843.16 IC6844.4(PWR:V-) IC6844.5(PWR:GND) IC6844.6 IC6844.7 IC6844.8 IC6844.9 IC6844.10 IC6844.11 IC6844.12(PWR:VCC) IC6844.13(PWR:V+) IC6844.14 IC6844.15 IC6844.16 IC6845.4(PWR:V-) IC6845.5(PWR:GND) IC6845.6 IC6845.7 IC6845.8 IC6845.9 IC6845.10 IC6845.11 IC6845.12(PWR:VCC) IC6845.13(PWR:V+) IC6845.14 IC6845.15 IC6845.16 IC6846.4(PWR:V-) IC6846.5(PWR:GND) IC6846.6 IC6846.7 IC6846.8 IC6846.9 IC6846.10 IC6846.11 IC6846.12(PWR:VCC) IC6846.13(PWR:V+) IC6846.14 IC6846.15 IC6846.16 IC6847.5(C:I) IC6847.6(C:O) IC6847.8(D:O) IC6847.9(D:I) IC6847.10(E:O) IC6847.11(E:I) IC6847.12(F:O) IC6847.13(F:I) IC6848.8(C:I0) IC6848.9(C:I1) IC6848.10(C:O) IC6848.11(D:I0) IC6848.12(D:I1) IC6848.13(D:O) IC6849.5(C:I) IC6849.6(C:O) IC6849.8(D:O) IC6849.9(D:I) IC6849.10(E:O) IC6849.11(E:I) IC6849.12(F:O) IC6849.13(F:I) IC6850.1(A:I) IC6850.2(A:O) IC6850.5(C:I) IC6850.6(C:O) IC6850.8(D:O) IC6850.9(D:I) IC6850.10(E:O) IC6850.11(E:I) IC6850.12(F:O) IC6850.13(F:I) IC6851.8(C:O) IC6851.9(C:I0) IC6851.10(C:I1) IC6851.11(D:O) IC6851.12(D:I0) IC6851.13(D:I1) IC6852.3(B:I) IC6852.4(B:O) IC6852.5(C:I) IC6852.6(C:O) IC6852.8(D:O) IC6852.9(D:I) IC6852.10(E:O) IC6852.11(E:I) IC6852.12(F:O) IC6852.13(F:I) IC6855.4(PWR:V-) IC6855.5(PWR:GND) IC6855.6 IC6855.7 IC6855.8 IC6855.9 IC6855.10 IC6855.11 IC6855.12(PWR:VCC) IC6855.13(PWR:V+) IC6855.14 IC6855.15 IC6855.16 IC6856.4(PWR:V-) IC6856.5(PWR:GND) IC6856.6 IC6856.7 IC6856.8 IC6856.9 IC6856.10 IC6856.11 IC6856.12(PWR:VCC) IC6856.13(PWR:V+) IC6856.14 IC6856.15 IC6856.16 IC6857.4(PWR:V-) IC6857.5(PWR:GND) IC6857.6 IC6857.7 IC6857.8 IC6857.9 IC6857.10 IC6857.11 IC6857.12(PWR:VCC) IC6857.13(PWR:V+) IC6857.14 IC6857.15 IC6857.16 IC6858.4(PWR:V-) IC6858.5(PWR:GND) IC6858.6 IC6858.7 IC6858.8 IC6858.9 IC6858.10 IC6858.11 IC6858.12(PWR:VCC) IC6858.13(PWR:V+) IC6858.14 IC6858.15 IC6858.16 IC6859.4(PWR:V-) IC6859.5(PWR:GND) IC6859.6 IC6859.7 IC6859.8 IC6859.9 IC6859.10 IC6859.11 IC6859.12(PWR:VCC) IC6859.13(PWR:V+) IC6859.14 IC6859.15 IC6859.16 IC6860.4(PWR:V-) IC6860.5(PWR:GND) IC6860.6 IC6860.7 IC6860.8 IC6860.9 IC6860.10 IC6860.11 IC6860.12(PWR:VCC) IC6860.13(PWR:V+) IC6860.14 IC6860.15 IC6860.16 IC6861.4(PWR:V-) IC6861.5(PWR:GND) IC6861.6 IC6861.7 IC6861.8 IC6861.9 IC6861.10 IC6861.11 IC6861.12(PWR:VCC) IC6861.13(PWR:V+) IC6861.14 IC6861.15 IC6861.16 IC6862.4(PWR:V-) IC6862.5(PWR:GND) IC6862.6 IC6862.7 IC6862.8 IC6862.9 IC6862.10 IC6862.11 IC6862.12(PWR:VCC) IC6862.13(PWR:V+) IC6862.14 IC6862.15 IC6862.16 IC6863.4(PWR:V-) IC6863.5(PWR:GND) IC6863.6 IC6863.7 IC6863.8 IC6863.9 IC6863.10 IC6863.11 IC6863.12(PWR:VCC) IC6863.13(PWR:V+) IC6863.14 IC6863.15 IC6863.16 IC6864.4(PWR:V-) IC6864.5(PWR:GND) IC6864.6 IC6864.7 IC6864.8 IC6864.9 IC6864.10 IC6864.11 IC6864.12(PWR:VCC) IC6864.13(PWR:V+) IC6864.14 IC6864.15 IC6864.16 IC6865.5(C:I) IC6865.6(C:O) IC6865.8(D:O) IC6865.9(D:I) IC6865.10(E:O) IC6865.11(E:I) IC6865.12(F:O) IC6865.13(F:I) IC6866.8(C:I0) IC6866.9(C:I1) IC6866.10(C:O) IC6866.11(D:I0) IC6866.12(D:I1) IC6866.13(D:O) IC6867.5(C:I) IC6867.6(C:O) IC6867.8(D:O) IC6867.9(D:I) IC6867.10(E:O) IC6867.11(E:I) IC6867.12(F:O) IC6867.13(F:I) IC6869.1(A:I) IC6869.2(A:O) IC6869.5(C:I) IC6869.6(C:O) IC6869.8(D:O) IC6869.9(D:I) IC6869.10(E:O) IC6869.11(E:I) IC6869.12(F:O) IC6869.13(F:I) IC6870.8(C:O) IC6870.9(C:I0) IC6870.10(C:I1) IC6870.11(D:O) IC6870.12(D:I0) IC6870.13(D:I1) IC6872.3(B:I) IC6872.4(B:O) IC6872.5(C:I) IC6872.6(C:O) IC6872.8(D:O) IC6872.9(D:I) IC6872.10(E:O) IC6872.11(E:I) IC6872.12(F:O) IC6872.13(F:I)

### Buses
B$12

### Notes on the sheet
- RS flipflop
- RS flipflop | inverter
- inverter
- /IRQP
- /NMIP
- RS flipflop
- inverter
- RESP
- PHI1
- PHI1
- inverter
- inverter
- /RES | PHI2
- PHI2
- PAD
- gating
- PHI2
- gating
- inverter | inverter
- gating
- inverter | inverter
- /NMI | /IRQ
- PAD | PAD
- 7405 | 7405 | 7405
- RS flipflop | 0 | 1 | RS flipflop | 1 | 0 | RS flipflop | 1 | 0
- RES | /NMIP | /IRQP
- 1 | 0 | 0 | 1 | 0 | 1
- PHI1 | PHI1
- 7405 | 7405 | 7405
- gating | gating | gating
- 7401 | 7401 | 7401 | 7401 | 7401 | 7401
- 0 | 1 | 0 | 1 | 0 | 1 | 0 | 0 | 1 | 0
- /RES | /NMI | /IRQ
- RESP
- PAD | PAD | PAD
- 1 | 1
- PHI2 | PHI2
- 0 | 1 | 0 | 0
- /RES | /NMI | /IRQ
- RS flipflop | RS flipflop
- PAD | PAD | PAD
- 1 | 1 | 1 | 0 | 0 | 0 | 0
- S | Q | RESP | S | Q | /NMIP | S | Q | /IRQP
- 1 | 1
- R | Q# | R | Q# | R | Q#
- 0 | 1 | 1
- PHI2 | RS flipflop
- PHI1
- 1 | 1 | 1
- PHI1
- PHI2 | PHI2
- PHI2 | PHI2 | PHI2
- dynamic
  latch
- dynamic
  latch
- 0 | 1 | 0 | 0 | 0 | 0
- /RES | /NMI | /IRQ
- RESP | /NMIP | /IRQP
- PAD | PAD | PAD
- static
  latch
- static
  latch
- static
  latch
- PHI1 | PHI1
- inverter
- RDY
- inverter
- RDY
- PAD
- inverter | 0
- /PRDY
- PHI2
- inverter | 0
- driver
- 1
- PHI1
- 1
- 0
- R/W
- PAD
- 1 | driver
- driver
- 1
- RDY
- 0 | 1
- SYNC | RDY
- inverter | 1 | 1
- PAD
- inverter | 1
- PAD
- driver
- driver
- PHI2
- inverter | 0 | 0
- inverter | 0 | 0
- 0
- 0
- 1
- /PRDY
- 1
- WR
- T1
- PHI1
- PHI1
- 74125
- RDY
- RDY
- PAD
- PHI2
- R/W
- 74125
- SYNC | WR
- T1 | PAD
- PAD
- /PRDY
- PHI1
- PHI1
- https://github.com/emu-russia/breaks/blob/master/BreakingNESWiki_DeepL/6502/pads.md
  19:pads

## Sheet 21 of 29
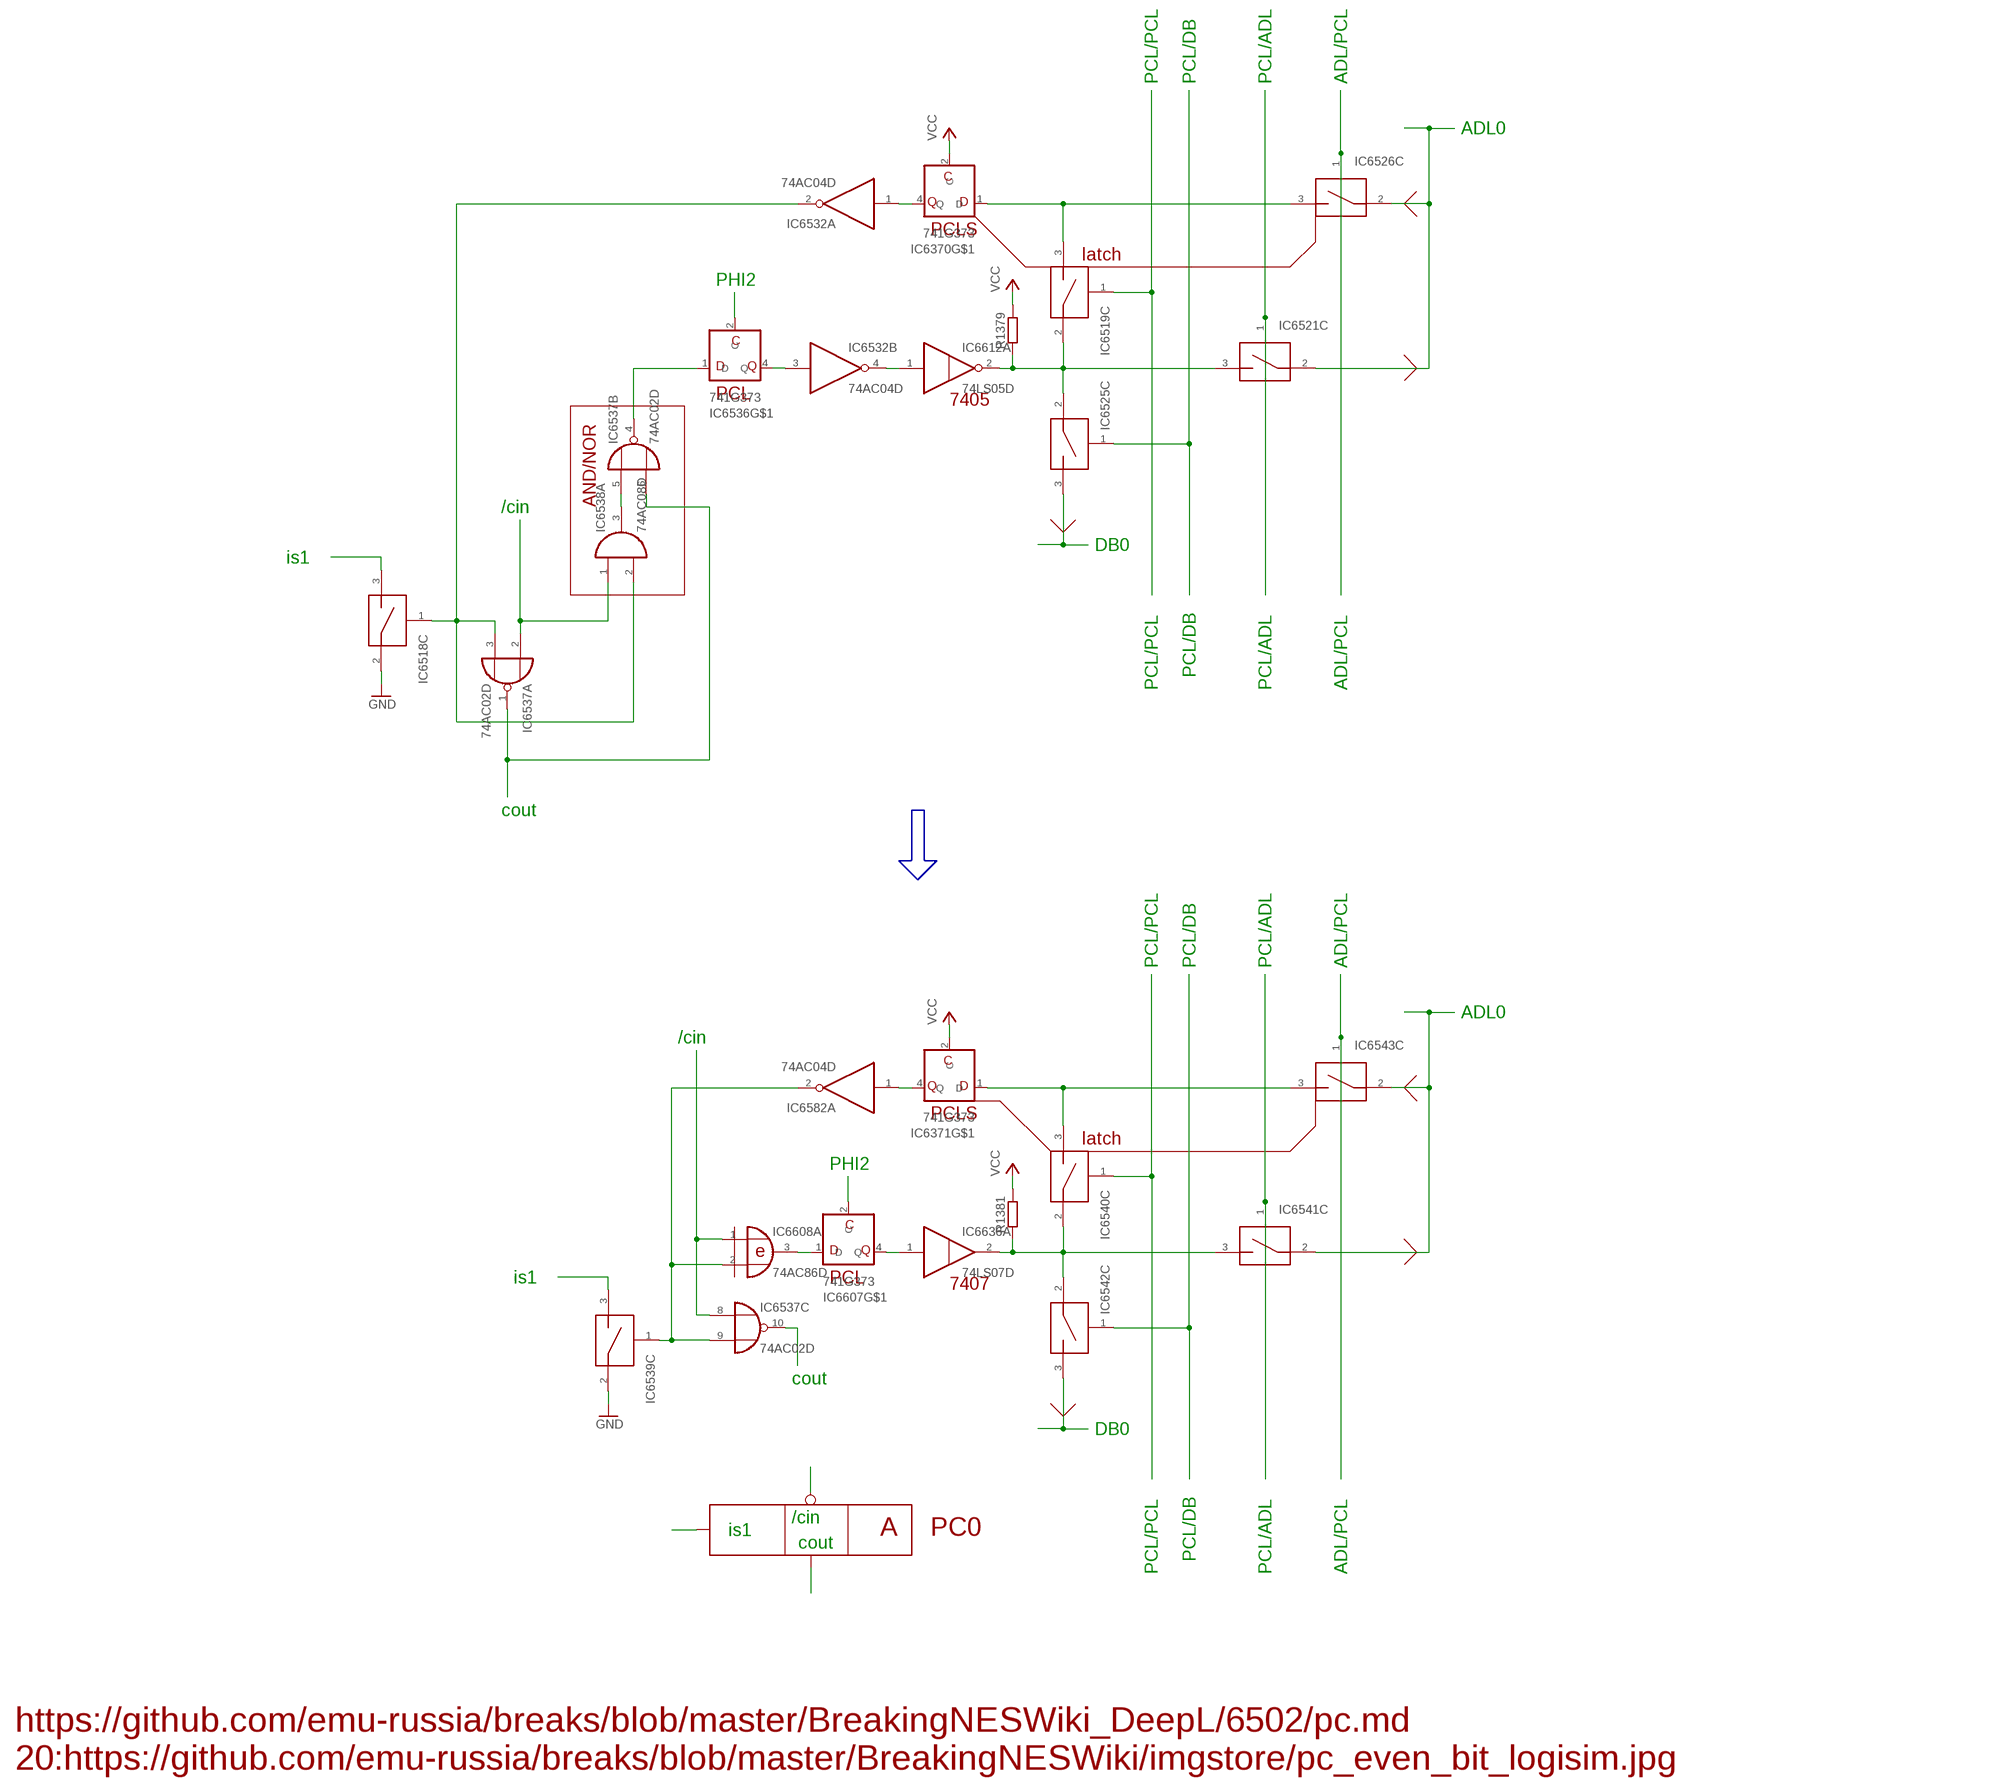
[diagram p29: schematic, sheet 21]

### Parts
IC6370  741G373  [DBV-R-PDSO-G5]
IC6371  741G373  [DBV-R-PDSO-G5]
IC6518  MAX4613SO16  [SO16]
IC6519  MAX4613SO16  [SO16]
IC6521  MAX4613SO16  [SO16]
IC6525  MAX4613SO16  [SO16]
IC6526  MAX4613SO16  [SO16]
IC6532  74AC04D  [SO14]
IC6536  741G373  [DBV-R-PDSO-G5]
IC6537  74AC02D  [SO14]
IC6538  74AC08D  [SO14]
IC6539  MAX4613SO16  [SO16]
IC6540  MAX4613SO16  [SO16]
IC6541  MAX4613SO16  [SO16]
IC6542  MAX4613SO16  [SO16]
IC6543  MAX4613SO16  [SO16]
IC6582  74AC04D  [SO14]
IC6607  741G373  [DBV-R-PDSO-G5]
IC6608  74AC86D  [SO14]
IC6612  74LS05D  [SO14]
IC6636  74LS07D  [SO14]
R1379  R-EU_R0603  [R0603]
R1381  R-EU_R0603  [R0603]

### Nets
GND: IC6518.2 IC6539.2 ; also sheet 1,2,3,4,9,10,11,12,13,14,19,20,22,23
N$11584: IC6370.4(Q) IC6532.1(A:I)
N$11605: IC6371.4(Q) IC6582.1(A:I)
N$11791: IC6536.2(C)
N$11792: IC6537.1(A:O) IC6537.6(B:I1)
N$11793: IC6518.3
N$11794: IC6537.2(A:I0) IC6538.1(A:I0)
N$11795: IC6532.3(B:I) IC6536.4(Q)
N$11796: IC6536.1(D) IC6537.4(B:O)
N$11797: IC6519.2 IC6521.3 IC6525.2 IC6612.2(A:O) R1379.1
N$11927: IC6370.1(D) IC6519.3 IC6526.3
N$11928: IC6525.3
N$11929: IC6525.1
N$11934: IC6519.1
N$11935: IC6521.1
N$11936: IC6521.2 IC6526.2
N$11937: IC6526.1
N$12010: IC6518.1 IC6532.2(A:O) IC6537.3(A:I1) IC6538.2(A:I1)
N$12027: IC6532.4(B:O) IC6612.1(A:I)
N$12031: IC6537.5(B:I0) IC6538.3(A:O)
N$12034: IC6607.2(C)
N$12037: IC6537.10(C:O)
N$12038: IC6539.3
N$12039: IC6537.8(C:I0) IC6608.1(A:I0)
N$12040: IC6540.2 IC6541.3 IC6542.2 IC6636.2(A:O) R1381.1
N$12041: IC6607.1(D) IC6608.3(A:O)
N$12042: IC6371.1(D) IC6540.3 IC6543.3
N$12043: IC6542.3
N$12059: IC6542.1
N$12239: IC6540.1
N$12240: IC6541.1
N$12241: IC6541.2 IC6543.2
N$12242: IC6543.1
N$12250: IC6537.9(C:I1) IC6539.1 IC6582.2(A:O) IC6608.2(A:I1)
N$12326: IC6607.4(Q) IC6636.1(A:I)
VCC: IC6370.2(C) IC6371.2(C) R1379.2 R1381.2 ; also sheet 1,2,3,4,9,11,12,13,19,20,22,23,26
Unconnected: IC6518.4(PWR:V-) IC6518.5(PWR:GND) IC6518.6 IC6518.7 IC6518.8 IC6518.9 IC6518.10 IC6518.11 IC6518.12(PWR:VCC) IC6518.13(PWR:V+) IC6518.14 IC6518.15 IC6518.16 IC6519.4(PWR:V-) IC6519.5(PWR:GND) IC6519.6 IC6519.7 IC6519.8 IC6519.9 IC6519.10 IC6519.11 IC6519.12(PWR:VCC) IC6519.13(PWR:V+) IC6519.14 IC6519.15 IC6519.16 IC6521.4(PWR:V-) IC6521.5(PWR:GND) IC6521.6 IC6521.7 IC6521.8 IC6521.9 IC6521.10 IC6521.11 IC6521.12(PWR:VCC) IC6521.13(PWR:V+) IC6521.14 IC6521.15 IC6521.16 IC6525.4(PWR:V-) IC6525.5(PWR:GND) IC6525.6 IC6525.7 IC6525.8 IC6525.9 IC6525.10 IC6525.11 IC6525.12(PWR:VCC) IC6525.13(PWR:V+) IC6525.14 IC6525.15 IC6525.16 IC6526.4(PWR:V-) IC6526.5(PWR:GND) IC6526.6 IC6526.7 IC6526.8 IC6526.9 IC6526.10 IC6526.11 IC6526.12(PWR:VCC) IC6526.13(PWR:V+) IC6526.14 IC6526.15 IC6526.16 IC6532.5(C:I) IC6532.6(C:O) IC6532.8(D:O) IC6532.9(D:I) IC6532.10(E:O) IC6532.11(E:I) IC6532.12(F:O) IC6532.13(F:I) IC6537.11(D:I0) IC6537.12(D:I1) IC6537.13(D:O) IC6538.4(B:I0) IC6538.5(B:I1) IC6538.6(B:O) IC6538.8(C:O) IC6538.9(C:I0) IC6538.10(C:I1) IC6538.11(D:O) IC6538.12(D:I0) IC6538.13(D:I1) IC6539.4(PWR:V-) IC6539.5(PWR:GND) IC6539.6 IC6539.7 IC6539.8 IC6539.9 IC6539.10 IC6539.11 IC6539.12(PWR:VCC) IC6539.13(PWR:V+) IC6539.14 IC6539.15 IC6539.16 IC6540.4(PWR:V-) IC6540.5(PWR:GND) IC6540.6 IC6540.7 IC6540.8 IC6540.9 IC6540.10 IC6540.11 IC6540.12(PWR:VCC) IC6540.13(PWR:V+) IC6540.14 IC6540.15 IC6540.16 IC6541.4(PWR:V-) IC6541.5(PWR:GND) IC6541.6 IC6541.7 IC6541.8 IC6541.9 IC6541.10 IC6541.11 IC6541.12(PWR:VCC) IC6541.13(PWR:V+) IC6541.14 IC6541.15 IC6541.16 IC6542.4(PWR:V-) IC6542.5(PWR:GND) IC6542.6 IC6542.7 IC6542.8 IC6542.9 IC6542.10 IC6542.11 IC6542.12(PWR:VCC) IC6542.13(PWR:V+) IC6542.14 IC6542.15 IC6542.16 IC6543.4(PWR:V-) IC6543.5(PWR:GND) IC6543.6 IC6543.7 IC6543.8 IC6543.9 IC6543.10 IC6543.11 IC6543.12(PWR:VCC) IC6543.13(PWR:V+) IC6543.14 IC6543.15 IC6543.16 IC6582.3(B:I) IC6582.4(B:O) IC6582.5(C:I) IC6582.6(C:O) IC6582.8(D:O) IC6582.9(D:I) IC6582.10(E:O) IC6582.11(E:I) IC6582.12(F:O) IC6582.13(F:I) IC6608.4(B:I0) IC6608.5(B:I1) IC6608.6(B:O) IC6608.8(C:O) IC6608.9(C:I0) IC6608.10(C:I1) IC6608.11(D:O) IC6608.12(D:I0) IC6608.13(D:I1) IC6612.3(B:I) IC6612.4(B:O) IC6612.5(C:I) IC6612.6(C:O) IC6612.8(D:O) IC6612.9(D:I) IC6612.10(E:O) IC6612.11(E:I) IC6612.12(F:O) IC6612.13(F:I) IC6636.3(B:I) IC6636.4(B:O) IC6636.5(C:I) IC6636.6(C:O) IC6636.8(D:O) IC6636.9(D:I) IC6636.10(E:O) IC6636.11(E:I) IC6636.12(F:O) IC6636.13(F:I)

### Buses
B$12

### Notes on the sheet
- PCL/PCL | PCL/DB | PCL/ADL | ADL/PCL
- ADL0
- PCLS
- latch
- PHI2
- PCL
- 7405
- AND/NOR
- /cin
- DB0
- is1
- PCL/DB
- PCL/PCL | PCL/ADL | ADL/PCL
- cout
- PCL/PCL | PCL/DB | PCL/ADL | ADL/PCL
- ADL0
- /cin
- PCLS
- latch
- PHI2
- is1 | PCL
- 7407
- cout
- DB0
- /cin
- is1 | A | PC0
- cout
- PCL/DB
- PCL/PCL | PCL/ADL | ADL/PCL
- https://github.com/emu-russia/breaks/blob/master/BreakingNESWiki_DeepL/6502/pc.md
  20:https://github.com/emu-russia/breaks/blob/master/BreakingNESWiki/imgstore/pc_even_bit_logisim.jpg

## Sheet 22 of 29
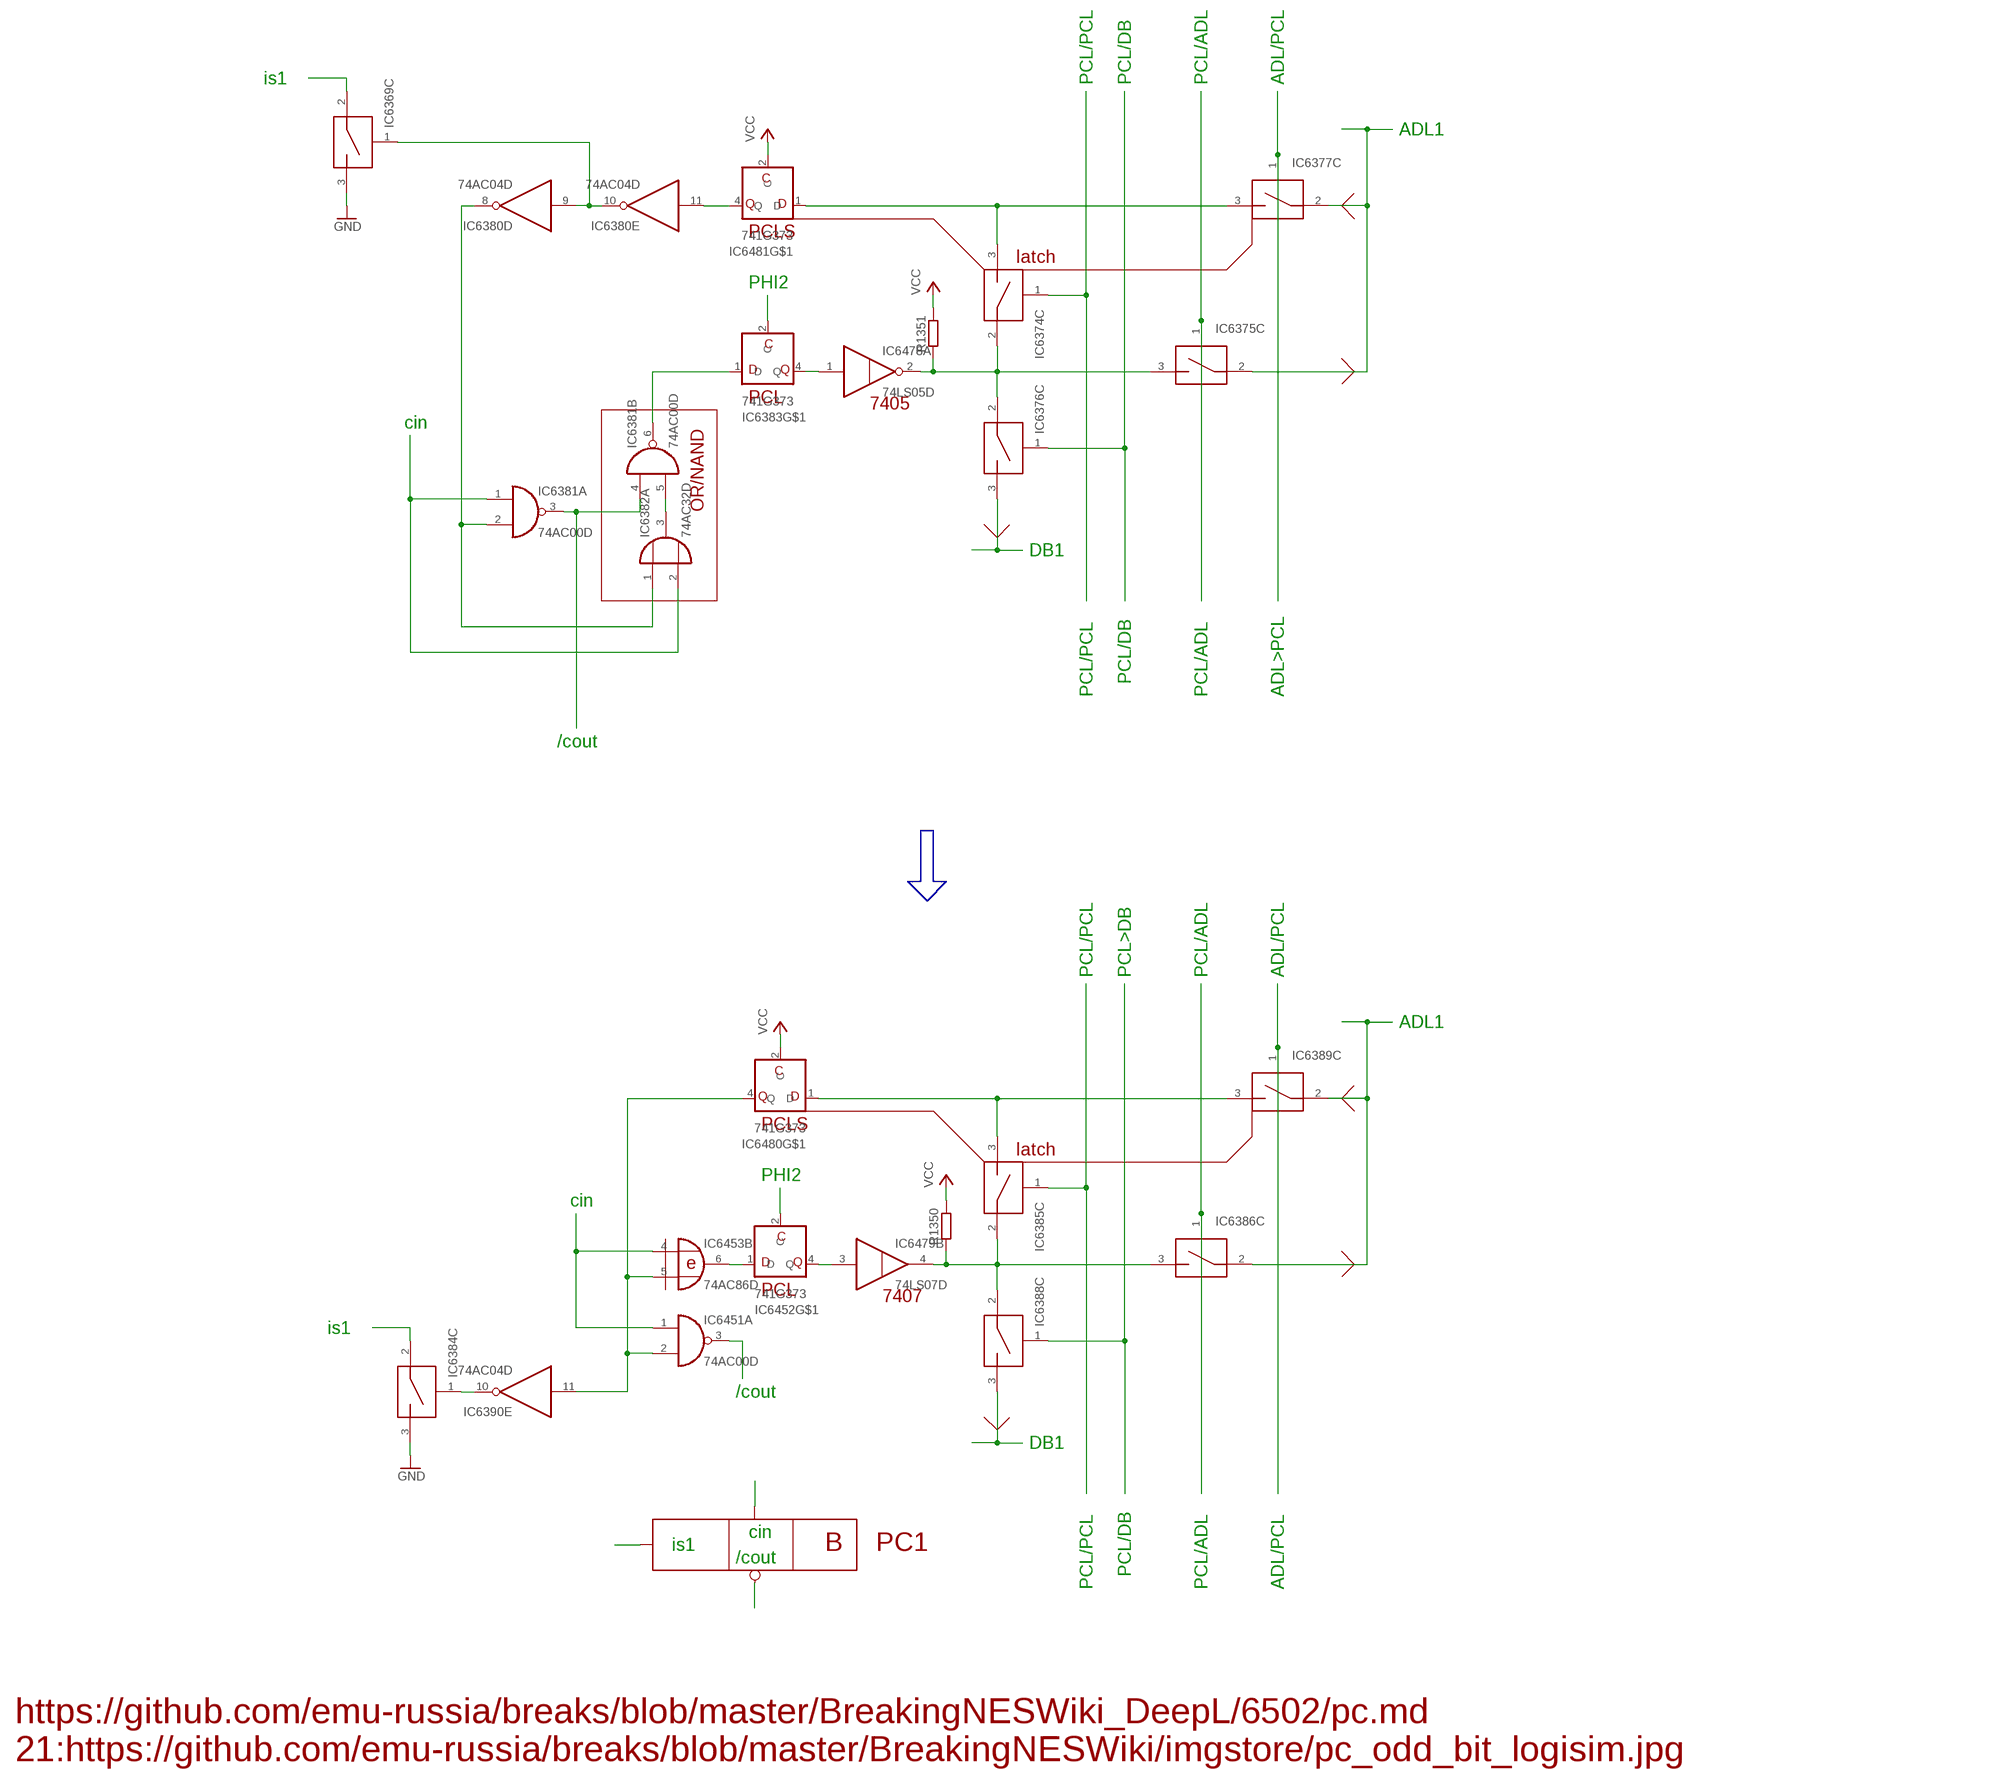
[diagram p30: schematic, sheet 22]

### Parts
IC6369  MAX4613SO16  [SO16]
IC6374  MAX4613SO16  [SO16]
IC6375  MAX4613SO16  [SO16]
IC6376  MAX4613SO16  [SO16]
IC6377  MAX4613SO16  [SO16]
IC6380  74AC04D  [SO14]
IC6381  74AC00D  [SO14]
IC6382  74AC32D  [SO14]
IC6383  741G373  [DBV-R-PDSO-G5]
IC6384  MAX4613SO16  [SO16]
IC6385  MAX4613SO16  [SO16]
IC6386  MAX4613SO16  [SO16]
IC6388  MAX4613SO16  [SO16]
IC6389  MAX4613SO16  [SO16]
IC6390  74AC04D  [SO14]
IC6451  74AC00D  [SO14]
IC6452  741G373  [DBV-R-PDSO-G5]
IC6453  74AC86D  [SO14]
IC6478  74LS05D  [SO14]
IC6479  74LS07D  [SO14]
IC6480  741G373  [DBV-R-PDSO-G5]
IC6481  741G373  [DBV-R-PDSO-G5]
R1350  R-EU_R0603  [R0603]
R1351  R-EU_R0603  [R0603]

### Nets
GND: IC6369.3 IC6384.3 ; also sheet 1,2,3,4,9,10,11,12,13,14,19,20,21,23
N$11713: IC6369.2
N$11714: IC6380.8(D:O) IC6381.2(A:I1) IC6382.1(A:I0)
N$11715: IC6369.1 IC6380.9(D:I) IC6380.10(E:O)
N$11716: IC6381.1(A:I0) IC6382.2(A:I1)
N$11718: IC6381.3(A:O) IC6381.4(B:I0)
N$11719: IC6381.6(B:O) IC6383.1(D)
N$11720: IC6383.4(Q) IC6478.1(A:I)
N$11721: IC6383.2(C)
N$11723: IC6374.2 IC6375.3 IC6376.2 IC6478.2(A:O) R1351.1
N$11724: IC6374.3 IC6377.3 IC6481.1(D)
N$11725: IC6376.3
N$11727: IC6376.1
N$11729: IC6374.1
N$11730: IC6375.1
N$11731: IC6375.2 IC6377.2
N$11732: IC6377.1
N$11735: IC6381.5(B:I1) IC6382.3(A:O)
N$11738: IC6384.2
N$11739: IC6384.1 IC6390.10(E:O)
N$11740: IC6451.1(A:I0) IC6453.4(B:I0)
N$11741: IC6451.3(A:O)
N$11743: IC6452.1(D) IC6453.6(B:O)
N$11744: IC6385.2 IC6386.3 IC6388.2 IC6479.4(B:O) R1350.1
N$11745: IC6452.2(C)
N$11746: IC6390.11(E:I) IC6451.2(A:I1) IC6453.5(B:I1) IC6480.4(Q)
N$11747: IC6388.3
N$11748: IC6388.1
N$11749: IC6385.1
N$11750: IC6386.1
N$11752: IC6386.2 IC6389.2
N$11753: IC6389.1
N$11789: IC6452.4(Q) IC6479.3(B:I)
N$11790: IC6385.3 IC6389.3 IC6480.1(D)
N$12275: IC6380.11(E:I) IC6481.4(Q)
VCC: IC6480.2(C) IC6481.2(C) R1350.2 R1351.2 ; also sheet 1,2,3,4,9,11,12,13,19,20,21,23,26
Unconnected: IC6369.4(PWR:V-) IC6369.5(PWR:GND) IC6369.6 IC6369.7 IC6369.8 IC6369.9 IC6369.10 IC6369.11 IC6369.12(PWR:VCC) IC6369.13(PWR:V+) IC6369.14 IC6369.15 IC6369.16 IC6374.4(PWR:V-) IC6374.5(PWR:GND) IC6374.6 IC6374.7 IC6374.8 IC6374.9 IC6374.10 IC6374.11 IC6374.12(PWR:VCC) IC6374.13(PWR:V+) IC6374.14 IC6374.15 IC6374.16 IC6375.4(PWR:V-) IC6375.5(PWR:GND) IC6375.6 IC6375.7 IC6375.8 IC6375.9 IC6375.10 IC6375.11 IC6375.12(PWR:VCC) IC6375.13(PWR:V+) IC6375.14 IC6375.15 IC6375.16 IC6376.4(PWR:V-) IC6376.5(PWR:GND) IC6376.6 IC6376.7 IC6376.8 IC6376.9 IC6376.10 IC6376.11 IC6376.12(PWR:VCC) IC6376.13(PWR:V+) IC6376.14 IC6376.15 IC6376.16 IC6377.4(PWR:V-) IC6377.5(PWR:GND) IC6377.6 IC6377.7 IC6377.8 IC6377.9 IC6377.10 IC6377.11 IC6377.12(PWR:VCC) IC6377.13(PWR:V+) IC6377.14 IC6377.15 IC6377.16 IC6380.1(A:I) IC6380.2(A:O) IC6380.3(B:I) IC6380.4(B:O) IC6380.5(C:I) IC6380.6(C:O) IC6380.12(F:O) IC6380.13(F:I) IC6381.8(C:O) IC6381.9(C:I0) IC6381.10(C:I1) IC6381.11(D:O) IC6381.12(D:I0) IC6381.13(D:I1) IC6382.4(B:I0) IC6382.5(B:I1) IC6382.6(B:O) IC6382.8(C:O) IC6382.9(C:I0) IC6382.10(C:I1) IC6382.11(D:O) IC6382.12(D:I0) IC6382.13(D:I1) IC6384.4(PWR:V-) IC6384.5(PWR:GND) IC6384.6 IC6384.7 IC6384.8 IC6384.9 IC6384.10 IC6384.11 IC6384.12(PWR:VCC) IC6384.13(PWR:V+) IC6384.14 IC6384.15 IC6384.16 IC6385.4(PWR:V-) IC6385.5(PWR:GND) IC6385.6 IC6385.7 IC6385.8 IC6385.9 IC6385.10 IC6385.11 IC6385.12(PWR:VCC) IC6385.13(PWR:V+) IC6385.14 IC6385.15 IC6385.16 IC6386.4(PWR:V-) IC6386.5(PWR:GND) IC6386.6 IC6386.7 IC6386.8 IC6386.9 IC6386.10 IC6386.11 IC6386.12(PWR:VCC) IC6386.13(PWR:V+) IC6386.14 IC6386.15 IC6386.16 IC6388.4(PWR:V-) IC6388.5(PWR:GND) IC6388.6 IC6388.7 IC6388.8 IC6388.9 IC6388.10 IC6388.11 IC6388.12(PWR:VCC) IC6388.13(PWR:V+) IC6388.14 IC6388.15 IC6388.16 IC6389.4(PWR:V-) IC6389.5(PWR:GND) IC6389.6 IC6389.7 IC6389.8 IC6389.9 IC6389.10 IC6389.11 IC6389.12(PWR:VCC) IC6389.13(PWR:V+) IC6389.14 IC6389.15 IC6389.16 IC6390.1(A:I) IC6390.2(A:O) IC6390.3(B:I) IC6390.4(B:O) IC6390.5(C:I) IC6390.6(C:O) IC6390.8(D:O) IC6390.9(D:I) IC6390.12(F:O) IC6390.13(F:I) IC6451.4(B:I0) IC6451.5(B:I1) IC6451.6(B:O) IC6451.8(C:O) IC6451.9(C:I0) IC6451.10(C:I1) IC6451.11(D:O) IC6451.12(D:I0) IC6451.13(D:I1) IC6453.1(A:I0) IC6453.2(A:I1) IC6453.3(A:O) IC6453.8(C:O) IC6453.9(C:I0) IC6453.10(C:I1) IC6453.11(D:O) IC6453.12(D:I0) IC6453.13(D:I1) IC6478.3(B:I) IC6478.4(B:O) IC6478.5(C:I) IC6478.6(C:O) IC6478.8(D:O) IC6478.9(D:I) IC6478.10(E:O) IC6478.11(E:I) IC6478.12(F:O) IC6478.13(F:I) IC6479.1(A:I) IC6479.2(A:O) IC6479.5(C:I) IC6479.6(C:O) IC6479.8(D:O) IC6479.9(D:I) IC6479.10(E:O) IC6479.11(E:I) IC6479.12(F:O) IC6479.13(F:I)

### Buses
B$12

### Notes on the sheet
- is1 | PCL/PCL | PCL/DB | PCL/ADL | ADL/PCL
- ADL1
- PCLS
- latch
- PHI2
- PCL
- 7405
- cin
- OR/NAND
- DB1
- PCL/DB
- PCL/PCL | PCL/ADL | ADL>PCL
- /cout
- PCL/PCL | PCL>DB | PCL/ADL | ADL/PCL
- ADL1
- PCLS
- latch
- PHI2
- cin
- PCL
- 7407
- is1
- /cout
- DB1
- cin
- is1 | B | PC1
- /cout
- PCL/DB
- PCL/PCL | PCL/ADL | ADL/PCL
- https://github.com/emu-russia/breaks/blob/master/BreakingNESWiki_DeepL/6502/pc.md
  21:https://github.com/emu-russia/breaks/blob/master/BreakingNESWiki/imgstore/pc_odd_bit_logisim.jpg

## Sheet 23 of 29
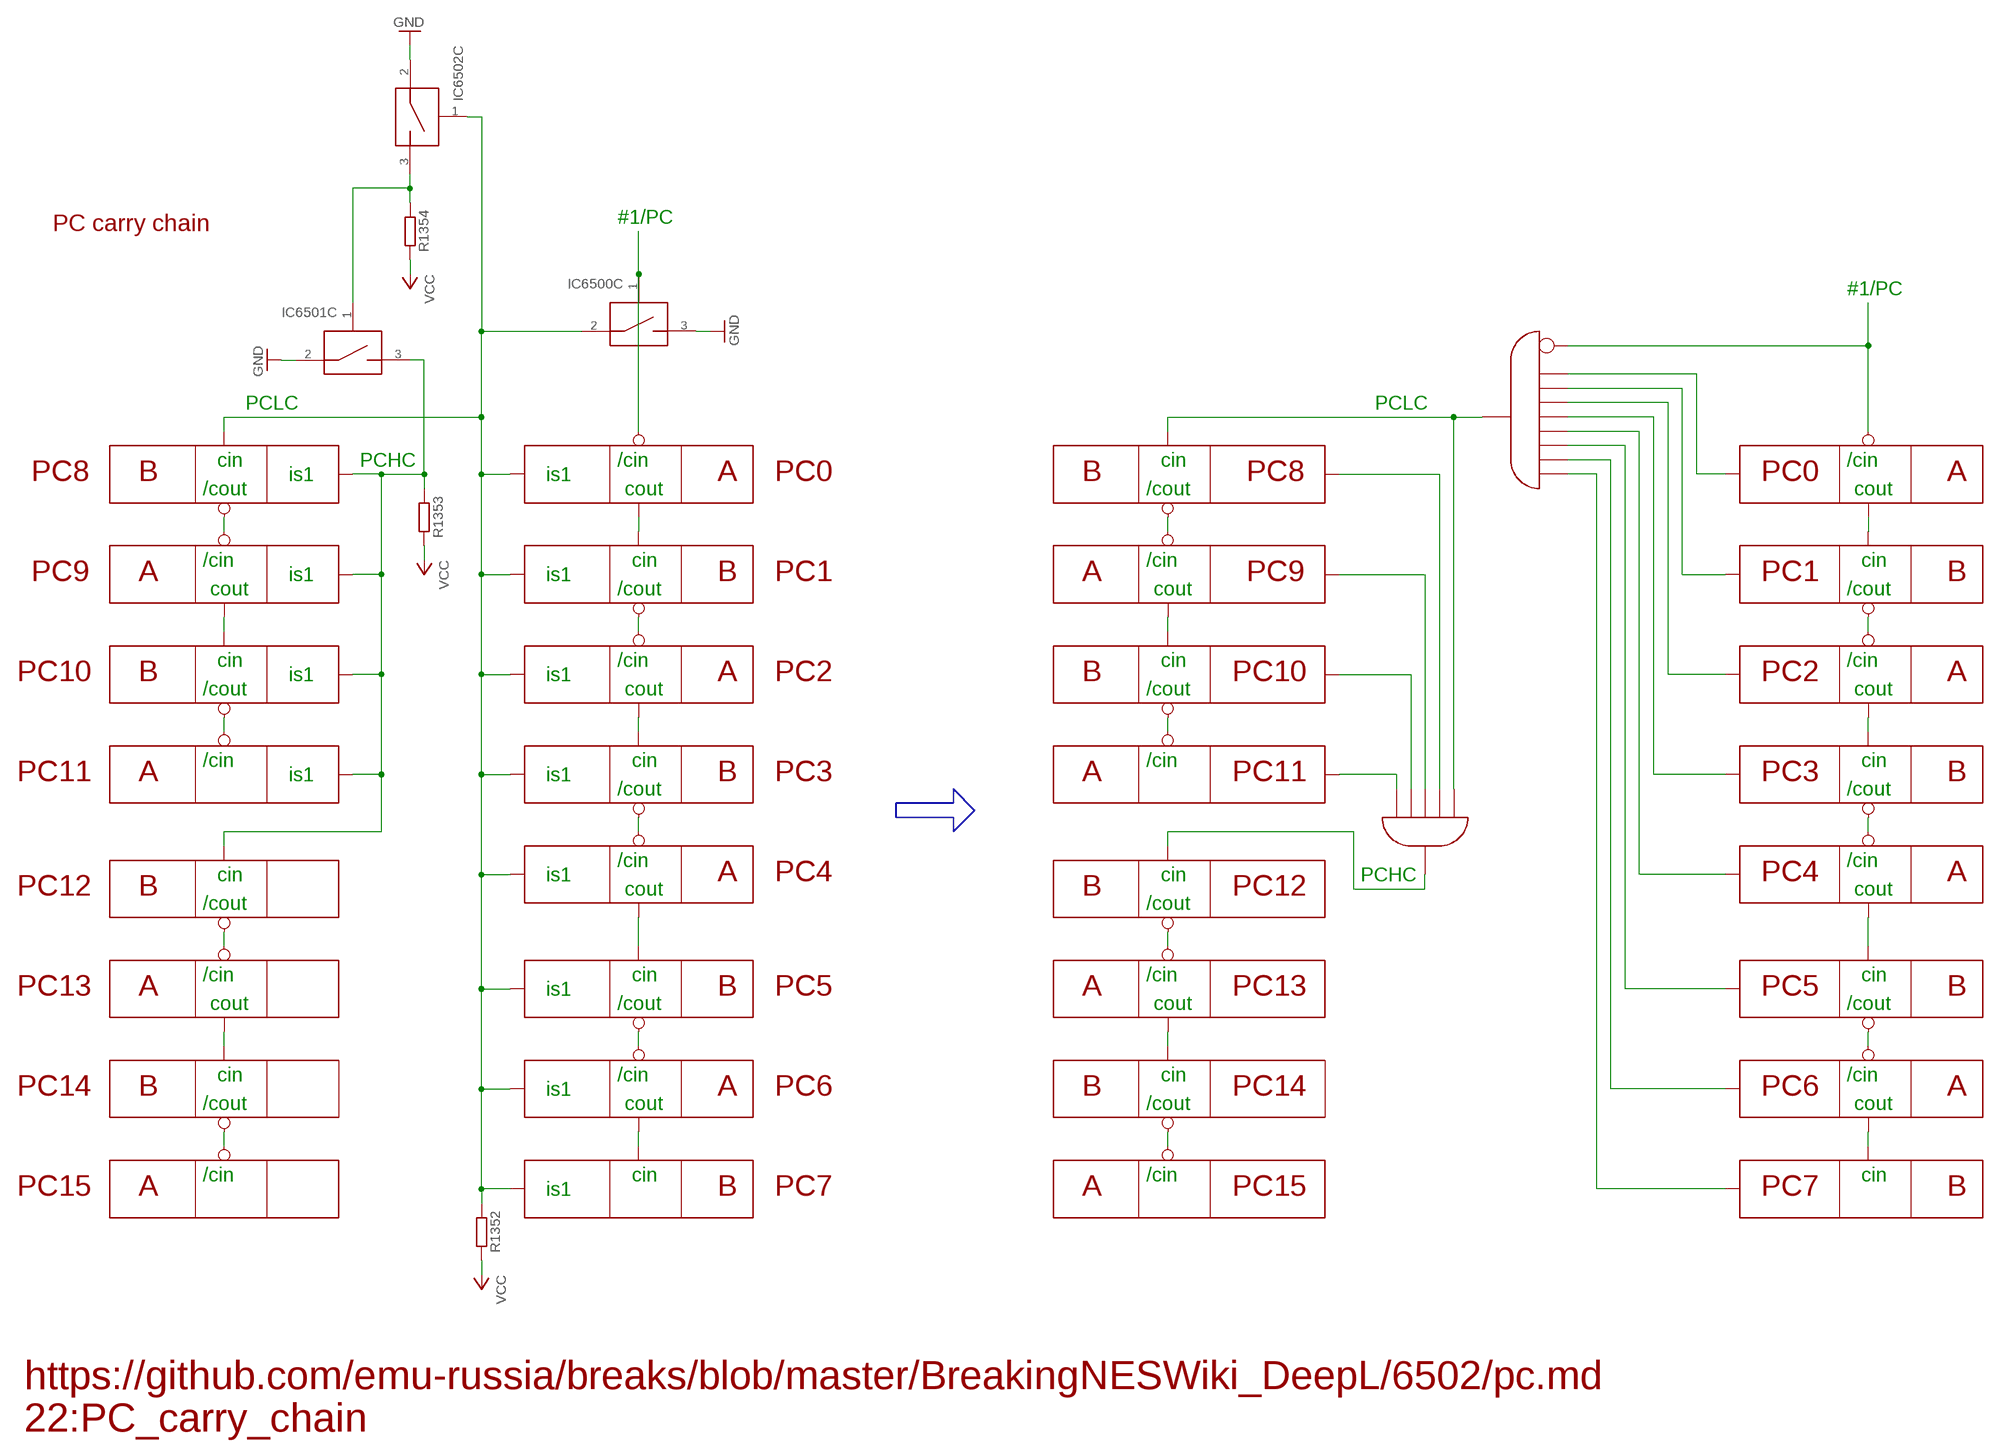
[diagram p31: schematic, sheet 23]

### Parts
IC6500  MAX4613SO16  [SO16]
IC6501  MAX4613SO16  [SO16]
IC6502  MAX4613SO16  [SO16]
R1352  R-EU_R0603  [R0603]
R1353  R-EU_R0603  [R0603]
R1354  R-EU_R0603  [R0603]

### Nets
GND: IC6500.3 IC6501.2 IC6502.2 ; also sheet 1,2,3,4,9,10,11,12,13,14,19,20,21,22
N$12450: IC6500.2 IC6502.1 R1352.1
N$12458: IC6501.3 R1353.1
N$12465: IC6500.1
N$12466: IC6501.1 IC6502.3 R1354.1
VCC: R1352.2 R1353.2 R1354.2 ; also sheet 1,2,3,4,9,11,12,13,19,20,21,22,26
Unconnected: IC6500.4(PWR:V-) IC6500.5(PWR:GND) IC6500.6 IC6500.7 IC6500.8 IC6500.9 IC6500.10 IC6500.11 IC6500.12(PWR:VCC) IC6500.13(PWR:V+) IC6500.14 IC6500.15 IC6500.16 IC6501.4(PWR:V-) IC6501.5(PWR:GND) IC6501.6 IC6501.7 IC6501.8 IC6501.9 IC6501.10 IC6501.11 IC6501.12(PWR:VCC) IC6501.13(PWR:V+) IC6501.14 IC6501.15 IC6501.16 IC6502.4(PWR:V-) IC6502.5(PWR:GND) IC6502.6 IC6502.7 IC6502.8 IC6502.9 IC6502.10 IC6502.11 IC6502.12(PWR:VCC) IC6502.13(PWR:V+) IC6502.14 IC6502.15 IC6502.16

### Buses
B$12

### Notes on the sheet
- #1/PC
- PC carry chain
- #1/PC
- PCLC | PCLC
- cin | PCHC | /cin | cin | /cin
- PC8 | B | is1 | is1 | A | PC0 | B | PC8 | PC0 | A
- /cout | cout | /cout | cout
- /cin | cin | /cin | cin
- PC9 | A | is1 | is1 | B | PC1 | A | PC9 | PC1 | B
- cout | /cout | cout | /cout
- cin | /cin | cin | /cin
- PC10 | B | is1 | is1 | A | PC2 | B | PC10 | PC2 | A
- /cout | cout | /cout | cout
- /cin | cin | /cin | cin
- PC11 | A | is1 | is1 | B | PC3 | A | PC11 | PC3 | B
- /cout | /cout
- /cin | /cin
- cin | is1 | A | PC4 | cin | PCHC | PC4 | A
- PC12 | B | cout | B | PC12 | cout
- /cout | /cout
- /cin | cin | /cin | cin
- PC13 | A | is1 | B | PC5 | A | PC13 | PC5 | B
- cout | /cout | cout | /cout
- cin | /cin | cin | /cin
- PC14 | B | is1 | A | PC6 | B | PC14 | PC6 | A
- /cout | cout | /cout | cout
- /cin | cin | /cin | cin
- PC15 | A | is1 | B | PC7 | A | PC15 | PC7 | B
- https://github.com/emu-russia/breaks/blob/master/BreakingNESWiki_DeepL/6502/pc.md
  22:PC_carry_chain

## Sheet 24 of 29
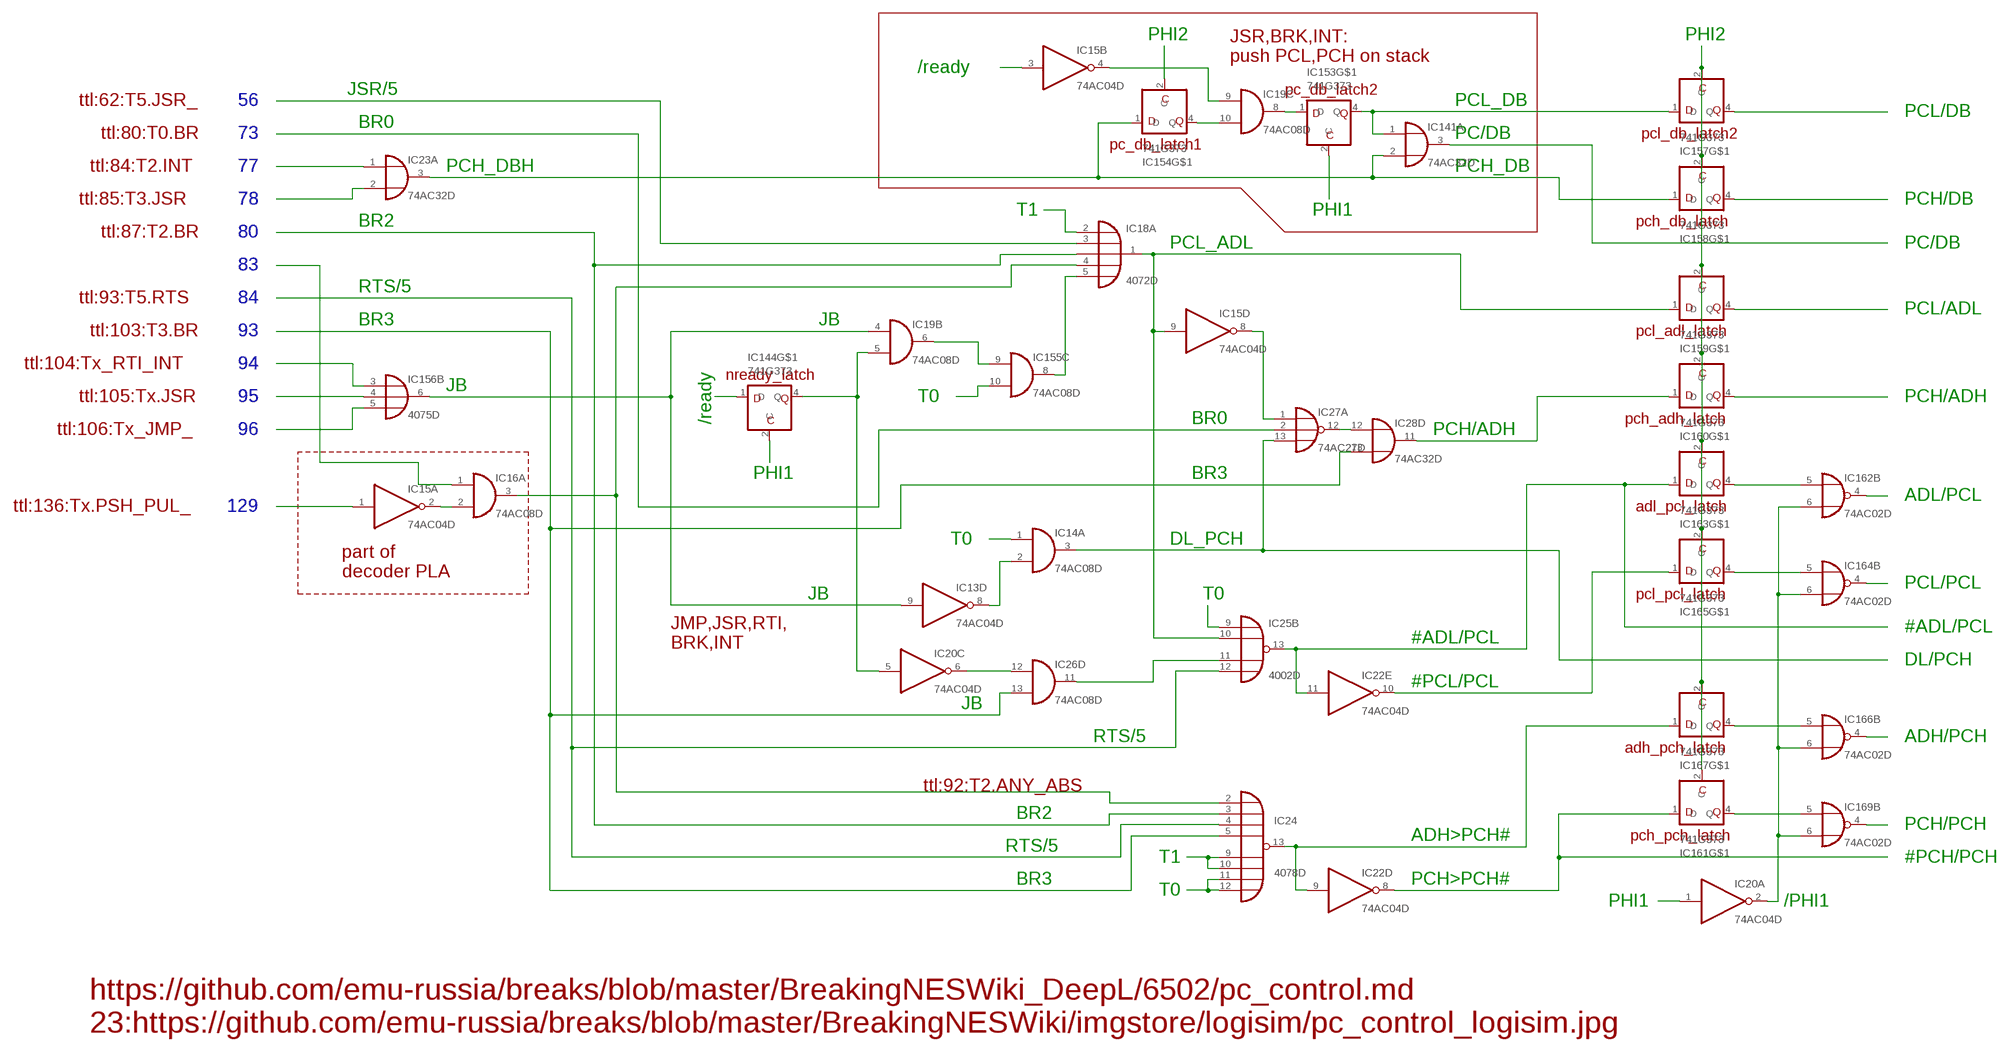
[diagram p32: schematic, sheet 24]

### Parts
IC13  74AC04D  [SO14]
IC14  74AC08D  [SO14]
IC15  74AC04D  [SO14]
IC16  74AC08D  [SO14]
IC18  4072D  [SO14]
IC19  74AC08D  [SO14]
IC20  74AC04D  [SO14]
IC22  74AC04D  [SO14]
IC23  74AC32D  [SO14]
IC24  4078D  [SO14]
IC25  4002D  [SO14]
IC26  74AC08D  [SO14]
IC27  74AC27D  [SO14]
IC28  74AC32D  [SO14]
IC141  74AC32D  [SO14]
IC144  741G373  [DBV-R-PDSO-G5]
IC153  741G373  [DBV-R-PDSO-G5]
IC154  741G373  [DBV-R-PDSO-G5]
IC155  74AC08D  [SO14]
IC156  4075D  [SO14]
IC157  741G373  [DBV-R-PDSO-G5]
IC158  741G373  [DBV-R-PDSO-G5]
IC159  741G373  [DBV-R-PDSO-G5]
IC160  741G373  [DBV-R-PDSO-G5]
IC161  741G373  [DBV-R-PDSO-G5]
IC162  74AC02D  [SO14]
IC163  741G373  [DBV-R-PDSO-G5]
IC164  74AC02D  [SO14]
IC165  741G373  [DBV-R-PDSO-G5]
IC166  74AC02D  [SO14]
IC167  741G373  [DBV-R-PDSO-G5]
IC169  74AC02D  [SO14]

### Nets
N$1: IC24.5(I3) IC26.13(D:I1) IC28.13(D:I1)
N$5: IC27.2(A:I1)
N$21: IC23.2(A:I1)
N$22: IC23.1(A:I0)
N$23: IC23.3(A:O) IC141.2(A:I1) IC154.1(D) IC158.1(D)
N$24: IC24.11(I6) IC24.12(I7)
N$25: IC154.2(C)
N$27: IC19.10(C:I1) IC154.4(Q)
N$28: IC19.8(C:O) IC153.1(D)
N$30: IC15.4(B:O) IC19.9(C:I0)
N$32: IC20.6(C:O) IC26.12(D:I0)
N$34: IC22.9(D:I) IC24.13(J) IC167.1(D)
N$35: IC25.9(B:I0)
N$37: IC141.1(A:I0) IC153.4(Q) IC157.1(D)
N$40: IC153.2(C)
N$41: IC15.9(D:I) IC18.1(A:O) IC25.10(B:I1) IC159.1(D)
N$43: IC18.5(A:I3) IC155.8(C:O)
N$44: IC14.1(A:I0)
N$46: IC14.3(A:O) IC27.13(A:I2)
N$48: IC27.12(A:O) IC28.12(D:I0)
N$274: IC20.2(A:O) IC162.6(B:I1) IC164.6(B:I1) IC166.6(B:I1) IC169.6(B:I1)
N$275: IC20.1(A:I)
N$276: IC24.4(I2) IC25.12(B:I3)
N$283: IC19.5(B:I1) IC20.5(C:I) IC144.4(Q)
N$284: IC19.6(B:O) IC155.9(C:I0)
N$287: IC16.3(A:O) IC18.4(A:I2) IC24.2(I0)
N$289: IC144.2(C)
N$293: IC144.1(D)
N$307: IC25.11(B:I2) IC26.11(D:O)
N$308: IC155.10(C:I1)
N$309: IC24.9(I4) IC24.10(I5)
N$310: IC24.3(I1)
N$311: IC13.8(D:O) IC14.2(A:I1)
N$312: IC18.3(A:I1)
N$313: IC141.3(A:O)
N$314: IC156.5(B:I2)
N$315: IC156.4(B:I1)
N$316: IC156.3(B:I0)
N$317: IC13.9(D:I) IC19.4(B:I0) IC156.6(B:O)
N$318: IC16.1(A:I0)
N$319: IC15.1(A:I)
N$320: IC15.2(A:O) IC16.2(A:I1)
N$321: IC22.10(E:O) IC165.1(D)
N$322: IC28.11(D:O) IC160.1(D)
N$323: IC157.4(Q)
N$324: IC158.4(Q)
N$325: IC160.4(Q)
N$326: IC161.4(Q) IC169.5(B:I0)
N$327: IC162.5(B:I0) IC163.4(Q)
N$328: IC162.4(B:O)
N$329: IC164.5(B:I0) IC165.4(Q)
N$330: IC164.4(B:O)
N$331: IC166.5(B:I0) IC167.4(Q)
N$332: IC166.4(B:O)
N$333: IC159.4(Q)
N$334: IC157.2(C) IC158.2(C) IC159.2(C) IC160.2(C) IC161.2(C) IC163.2(C) IC165.2(C) IC167.2(C)
N$335: IC22.11(E:I) IC25.13(B:O) IC163.1(D)
N$336: IC169.4(B:O)
N$337: IC22.8(D:O) IC161.1(D)
N$338: IC15.3(B:I)
N$339: IC15.8(D:O) IC27.1(A:I0)
N$340: IC18.2(A:I0)
Unconnected: IC13.1(A:I) IC13.2(A:O) IC13.3(B:I) IC13.4(B:O) IC13.5(C:I) IC13.6(C:O) IC13.10(E:O) IC13.11(E:I) IC13.12(F:O) IC13.13(F:I) IC14.4(B:I0) IC14.5(B:I1) IC14.6(B:O) IC14.8(C:O) IC14.9(C:I0) IC14.10(C:I1) IC14.11(D:O) IC14.12(D:I0) IC14.13(D:I1) IC15.5(C:I) IC15.6(C:O) IC15.10(E:O) IC15.11(E:I) IC15.12(F:O) IC15.13(F:I) IC16.4(B:I0) IC16.5(B:I1) IC16.6(B:O) IC16.8(C:O) IC16.9(C:I0) IC16.10(C:I1) IC16.11(D:O) IC16.12(D:I0) IC16.13(D:I1) IC18.9(B:I0) IC18.10(B:I1) IC18.11(B:I2) IC18.12(B:I3) IC18.13(B:O) IC19.1(A:I0) IC19.2(A:I1) IC19.3(A:O) IC19.11(D:O) IC19.12(D:I0) IC19.13(D:I1) IC20.3(B:I) IC20.4(B:O) IC20.8(D:O) IC20.9(D:I) IC20.10(E:O) IC20.11(E:I) IC20.12(F:O) IC20.13(F:I) IC22.1(A:I) IC22.2(A:O) IC22.3(B:I) IC22.4(B:O) IC22.5(C:I) IC22.6(C:O) IC22.12(F:O) IC22.13(F:I) IC23.4(B:I0) IC23.5(B:I1) IC23.6(B:O) IC23.8(C:O) IC23.9(C:I0) IC23.10(C:I1) IC23.11(D:O) IC23.12(D:I0) IC23.13(D:I1) IC25.1(A:O) IC25.2(A:I0) IC25.3(A:I1) IC25.4(A:I2) IC25.5(A:I3) IC26.1(A:I0) IC26.2(A:I1) IC26.3(A:O) IC26.4(B:I0) IC26.5(B:I1) IC26.6(B:O) IC26.8(C:O) IC26.9(C:I0) IC26.10(C:I1) IC27.3(B:I0) IC27.4(B:I1) IC27.5(B:I2) IC27.6(B:O) IC27.8(C:O) IC27.9(C:I0) IC27.10(C:I1) IC27.11(C:I2) IC28.1(A:I0) IC28.2(A:I1) IC28.3(A:O) IC28.4(B:I0) IC28.5(B:I1) IC28.6(B:O) IC28.8(C:O) IC28.9(C:I0) IC28.10(C:I1) IC141.4(B:I0) IC141.5(B:I1) IC141.6(B:O) IC141.8(C:O) IC141.9(C:I0) IC141.10(C:I1) IC141.11(D:O) IC141.12(D:I0) IC141.13(D:I1) IC155.1(A:I0) IC155.2(A:I1) IC155.3(A:O) IC155.4(B:I0) IC155.5(B:I1) IC155.6(B:O) IC155.11(D:O) IC155.12(D:I0) IC155.13(D:I1) IC156.1(A:I0) IC156.2(A:I1) IC156.8(A:I2) IC156.9(A:O) IC156.10(C:O) IC156.11(C:I0) IC156.12(C:I1) IC156.13(C:I2) IC162.1(A:O) IC162.2(A:I0) IC162.3(A:I1) IC162.8(C:I0) IC162.9(C:I1) IC162.10(C:O) IC162.11(D:I0) IC162.12(D:I1) IC162.13(D:O) IC164.1(A:O) IC164.2(A:I0) IC164.3(A:I1) IC164.8(C:I0) IC164.9(C:I1) IC164.10(C:O) IC164.11(D:I0) IC164.12(D:I1) IC164.13(D:O) IC166.1(A:O) IC166.2(A:I0) IC166.3(A:I1) IC166.8(C:I0) IC166.9(C:I1) IC166.10(C:O) IC166.11(D:I0) IC166.12(D:I1) IC166.13(D:O) IC169.1(A:O) IC169.2(A:I0) IC169.3(A:I1) IC169.8(C:I0) IC169.9(C:I1) IC169.10(C:O) IC169.11(D:I0) IC169.12(D:I1) IC169.13(D:O)

### Notes on the sheet
- PHI2 | PHI2
- JSR,BRK,INT:
  push PCL,PCH on stack
- /ready
- JSR/5 | pc_db_latch2
- ttl:62:T5.JSR_ | 56 | PCL_DB
- PCL/DB
- BR0
- ttl:80:T0.BR | 73 | PC/DB | pcl_db_latch2
- pc_db_latch1
- ttl:84:T2.INT | 77 | PCH_DBH | PCH_DB
- ttl:85:T3.JSR | 78 | PCH/DB
- T1 | PHI1
- BR2 | pch_db_latch
- ttl:87:T2.BR | 80
- PCL_ADL | PC/DB
- 83
- RTS/5
- ttl:93:T5.RTS | 84
- PCL/ADL
- BR3 | JB
- ttl:103:T3.BR | 93 | pcl_adl_latch
- ttl:104:Tx_RTI_INT | 94
- nready_latch
- JB
- ttl:105:Tx.JSR | 95 | T0 | PCH/ADH
- /ready | BR0 | pch_adh_latch
- ttl:106:Tx_JMP_ | 96 | PCH/ADH
- PHI1 | BR3
- ADL/PCL
- ttl:136:Tx.PSH_PUL_ | 129 | adl_pcl_latch
- T0 | DL_PCH
- part of 
  decoder PLA
- PCL/PCL
- JB | T0 | pcl_pcl_latch
- #ADL/PCL
- #ADL/PCL
- JMP,JSR,RTI,
  BRK,INT
- DL/PCH
- #PCL/PCL
- JB
- RTS/5 | ADH/PCH
- adh_pch_latch
- ttl:92:T2.ANY_ABS
- BR2
- PCH/PCH
- ADH>PCH# | pch_pch_latch
- RTS/5
- T1 | #PCH/PCH
- BR3 | PCH>PCH#
- T0
- PHI1 | /PHI1
- https://github.com/emu-russia/breaks/blob/master/BreakingNESWiki_DeepL/6502/pc_control.md
  23:https://github.com/emu-russia/breaks/blob/master/BreakingNESWiki/imgstore/logisim/pc_control_logisim.jpg

## Sheet 25 of 29
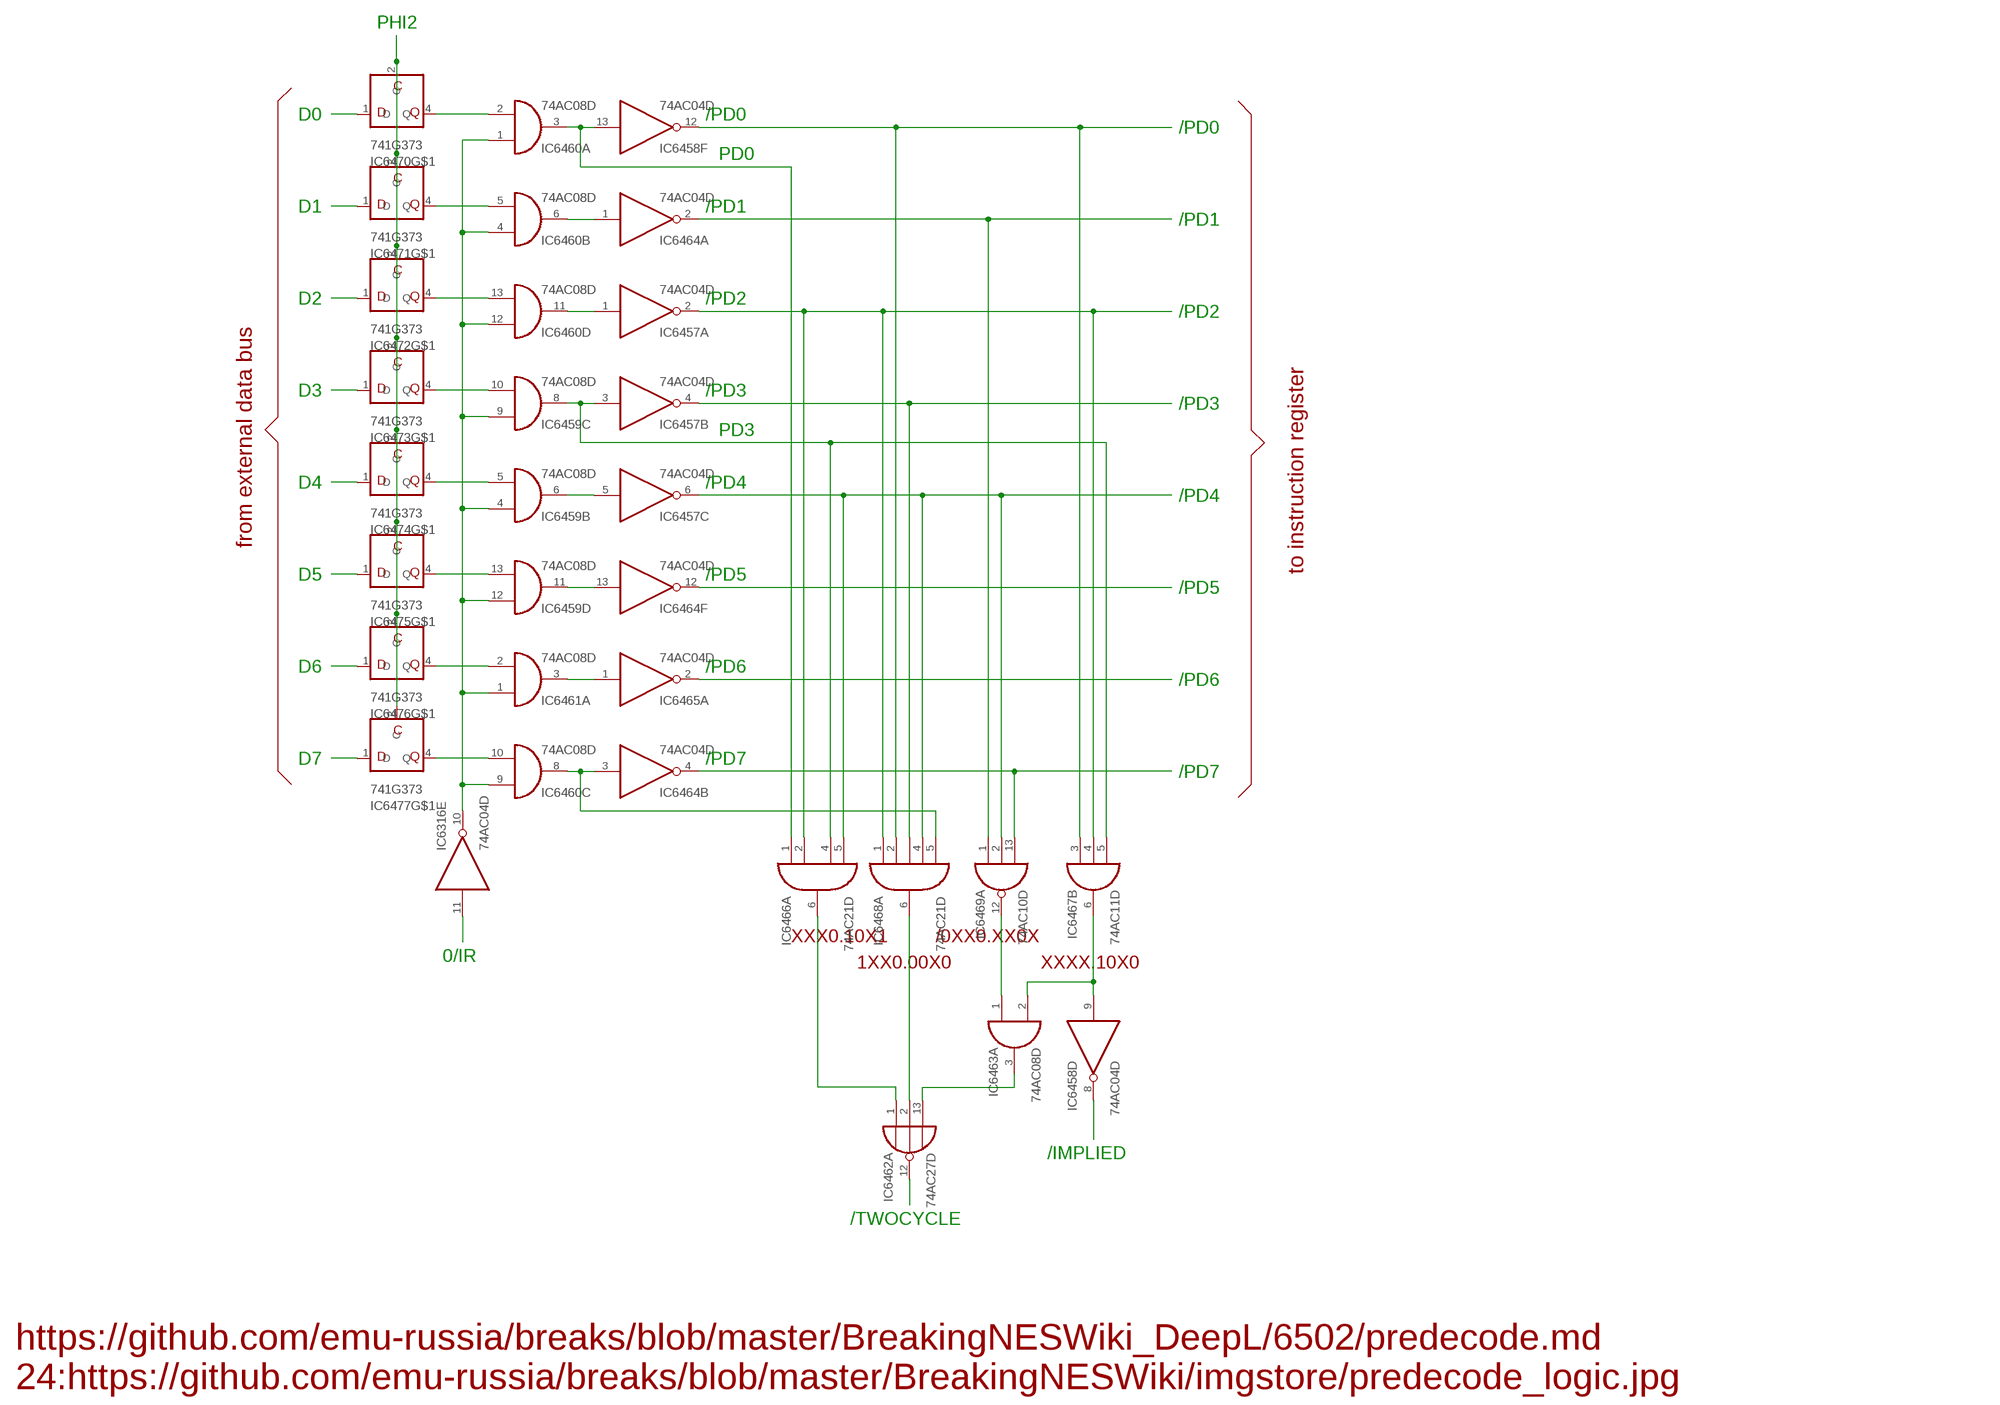
[diagram p33: schematic, sheet 25]

### Parts
IC6316  74AC04D  [SO14]
IC6457  74AC04D  [SO14]
IC6458  74AC04D  [SO14]
IC6459  74AC08D  [SO14]
IC6460  74AC08D  [SO14]
IC6461  74AC08D  [SO14]
IC6462  74AC27D  [SO14]
IC6463  74AC08D  [SO14]
IC6464  74AC04D  [SO14]
IC6465  74AC04D  [SO14]
IC6466  74AC21D  [SO14]
IC6467  74AC11D  [SO14]
IC6468  74AC21D  [SO14]
IC6469  74AC10D  [SO14]
IC6470  741G373  [DBV-R-PDSO-G5]
IC6471  741G373  [DBV-R-PDSO-G5]
IC6472  741G373  [DBV-R-PDSO-G5]
IC6473  741G373  [DBV-R-PDSO-G5]
IC6474  741G373  [DBV-R-PDSO-G5]
IC6475  741G373  [DBV-R-PDSO-G5]
IC6476  741G373  [DBV-R-PDSO-G5]
IC6477  741G373  [DBV-R-PDSO-G5]

### Nets
N$11798: IC6316.10(E:O) IC6459.4(B:I0) IC6459.9(C:I0) IC6459.12(D:I0) IC6460.1(A:I0) IC6460.4(B:I0) IC6460.9(C:I0) IC6460.12(D:I0) IC6461.1(A:I0)
N$11799: IC6457.6(C:O) IC6466.5(A:I3) IC6468.4(A:I2) IC6469.2(A:I1)
N$11800: IC6459.5(B:I1) IC6474.4(Q)
N$11801: IC6459.10(C:I1) IC6473.4(Q)
N$11802: IC6459.13(D:I1) IC6475.4(Q)
N$11803: IC6460.2(A:I1) IC6470.4(Q)
N$11804: IC6460.5(B:I1) IC6471.4(Q)
N$11805: IC6460.10(C:I1) IC6477.4(Q)
N$11806: IC6460.13(D:I1) IC6472.4(Q)
N$11807: IC6461.2(A:I1) IC6476.4(Q)
N$11808: IC6459.11(D:O) IC6464.13(F:I)
N$11810: IC6464.2(A:O) IC6469.1(A:I0)
N$11811: IC6460.8(C:O) IC6464.3(B:I) IC6468.5(A:I3)
N$11812: IC6461.3(A:O) IC6465.1(A:I)
N$11813: IC6457.2(A:O) IC6466.2(A:I1) IC6467.4(B:I1) IC6468.1(A:I0)
N$11814: IC6458.13(F:I) IC6460.3(A:O) IC6466.1(A:I0)
N$11815: IC6462.2(A:I1) IC6468.6(A:O)
N$11816: IC6458.9(D:I) IC6463.2(A:I1) IC6467.6(B:O)
N$11817: IC6462.1(A:I0) IC6466.6(A:O)
N$11818: IC6457.4(B:O)
N$11819: IC6464.4(B:O) IC6469.13(A:I2)
N$11820: IC6458.12(F:O) IC6467.3(B:I0) IC6468.2(A:I1)
N$11821: IC6465.2(A:O)
N$11822: IC6464.12(F:O)
N$11823: IC6462.12(A:O)
N$11825: IC6463.1(A:I0) IC6469.12(A:O)
N$11826: IC6458.8(D:O)
N$11827: IC6462.13(A:I2) IC6463.3(A:O)
N$11828: IC6460.6(B:O) IC6464.1(A:I)
N$11829: IC6457.1(A:I) IC6460.11(D:O)
N$11830: IC6457.3(B:I) IC6459.8(C:O) IC6466.4(A:I2) IC6467.5(B:I2)
N$11831: IC6457.5(C:I) IC6459.6(B:O)
N$11832: IC6316.11(E:I)
N$11870: IC6470.2(C) IC6471.2(C) IC6472.2(C) IC6473.2(C) IC6474.2(C) IC6475.2(C) IC6476.2(C) IC6477.2(C)
N$11881: IC6477.1(D)
N$11916: IC6476.1(D)
N$11920: IC6475.1(D)
N$11922: IC6474.1(D)
N$11923: IC6473.1(D)
N$11924: IC6472.1(D)
N$11925: IC6471.1(D)
N$11926: IC6470.1(D)
Unconnected: IC6316.1(A:I) IC6316.2(A:O) IC6316.3(B:I) IC6316.4(B:O) IC6316.5(C:I) IC6316.6(C:O) IC6316.8(D:O) IC6316.9(D:I) IC6316.12(F:O) IC6316.13(F:I) IC6457.8(D:O) IC6457.9(D:I) IC6457.10(E:O) IC6457.11(E:I) IC6457.12(F:O) IC6457.13(F:I) IC6458.1(A:I) IC6458.2(A:O) IC6458.3(B:I) IC6458.4(B:O) IC6458.5(C:I) IC6458.6(C:O) IC6458.10(E:O) IC6458.11(E:I) IC6459.1(A:I0) IC6459.2(A:I1) IC6459.3(A:O) IC6461.4(B:I0) IC6461.5(B:I1) IC6461.6(B:O) IC6461.8(C:O) IC6461.9(C:I0) IC6461.10(C:I1) IC6461.11(D:O) IC6461.12(D:I0) IC6461.13(D:I1) IC6462.3(B:I0) IC6462.4(B:I1) IC6462.5(B:I2) IC6462.6(B:O) IC6462.8(C:O) IC6462.9(C:I0) IC6462.10(C:I1) IC6462.11(C:I2) IC6463.4(B:I0) IC6463.5(B:I1) IC6463.6(B:O) IC6463.8(C:O) IC6463.9(C:I0) IC6463.10(C:I1) IC6463.11(D:O) IC6463.12(D:I0) IC6463.13(D:I1) IC6464.5(C:I) IC6464.6(C:O) IC6464.8(D:O) IC6464.9(D:I) IC6464.10(E:O) IC6464.11(E:I) IC6465.3(B:I) IC6465.4(B:O) IC6465.5(C:I) IC6465.6(C:O) IC6465.8(D:O) IC6465.9(D:I) IC6465.10(E:O) IC6465.11(E:I) IC6465.12(F:O) IC6465.13(F:I) IC6466.8(B:O) IC6466.9(B:I0) IC6466.10(B:I1) IC6466.12(B:I2) IC6466.13(B:I3) IC6467.1(A:I0) IC6467.2(A:I1) IC6467.8(C:O) IC6467.9(C:I0) IC6467.10(C:I1) IC6467.11(C:I2) IC6467.12(A:O) IC6467.13(A:I2) IC6468.8(B:O) IC6468.9(B:I0) IC6468.10(B:I1) IC6468.12(B:I2) IC6468.13(B:I3) IC6469.3(B:I0) IC6469.4(B:I1) IC6469.5(B:I2) IC6469.6(B:O) IC6469.8(C:O) IC6469.9(C:I0) IC6469.10(C:I1) IC6469.11(C:I2)

### Notes on the sheet
- PHI2
- D0 | /PD0
- /PD0
- PD0
- D1 | /PD1
- /PD1
- D2 | /PD2
- /PD2
- D3 | /PD3
- /PD3
- PD3
- D4 | /PD4
- /PD4
- from external data bus
- to instruction register
- D5 | /PD5
- /PD5
- D6 | /PD6
- /PD6
- D7 | /PD7
- /PD7
- XXX0.10X1 | /0XX0.XX0X
- 0/IR
- 1XX0.00X0 | XXXX.10X0
- /IMPLIED
- /TWOCYCLE
- https://github.com/emu-russia/breaks/blob/master/BreakingNESWiki_DeepL/6502/predecode.md
  24:https://github.com/emu-russia/breaks/blob/master/BreakingNESWiki/imgstore/predecode_logic.jpg

## Sheet 26 of 29
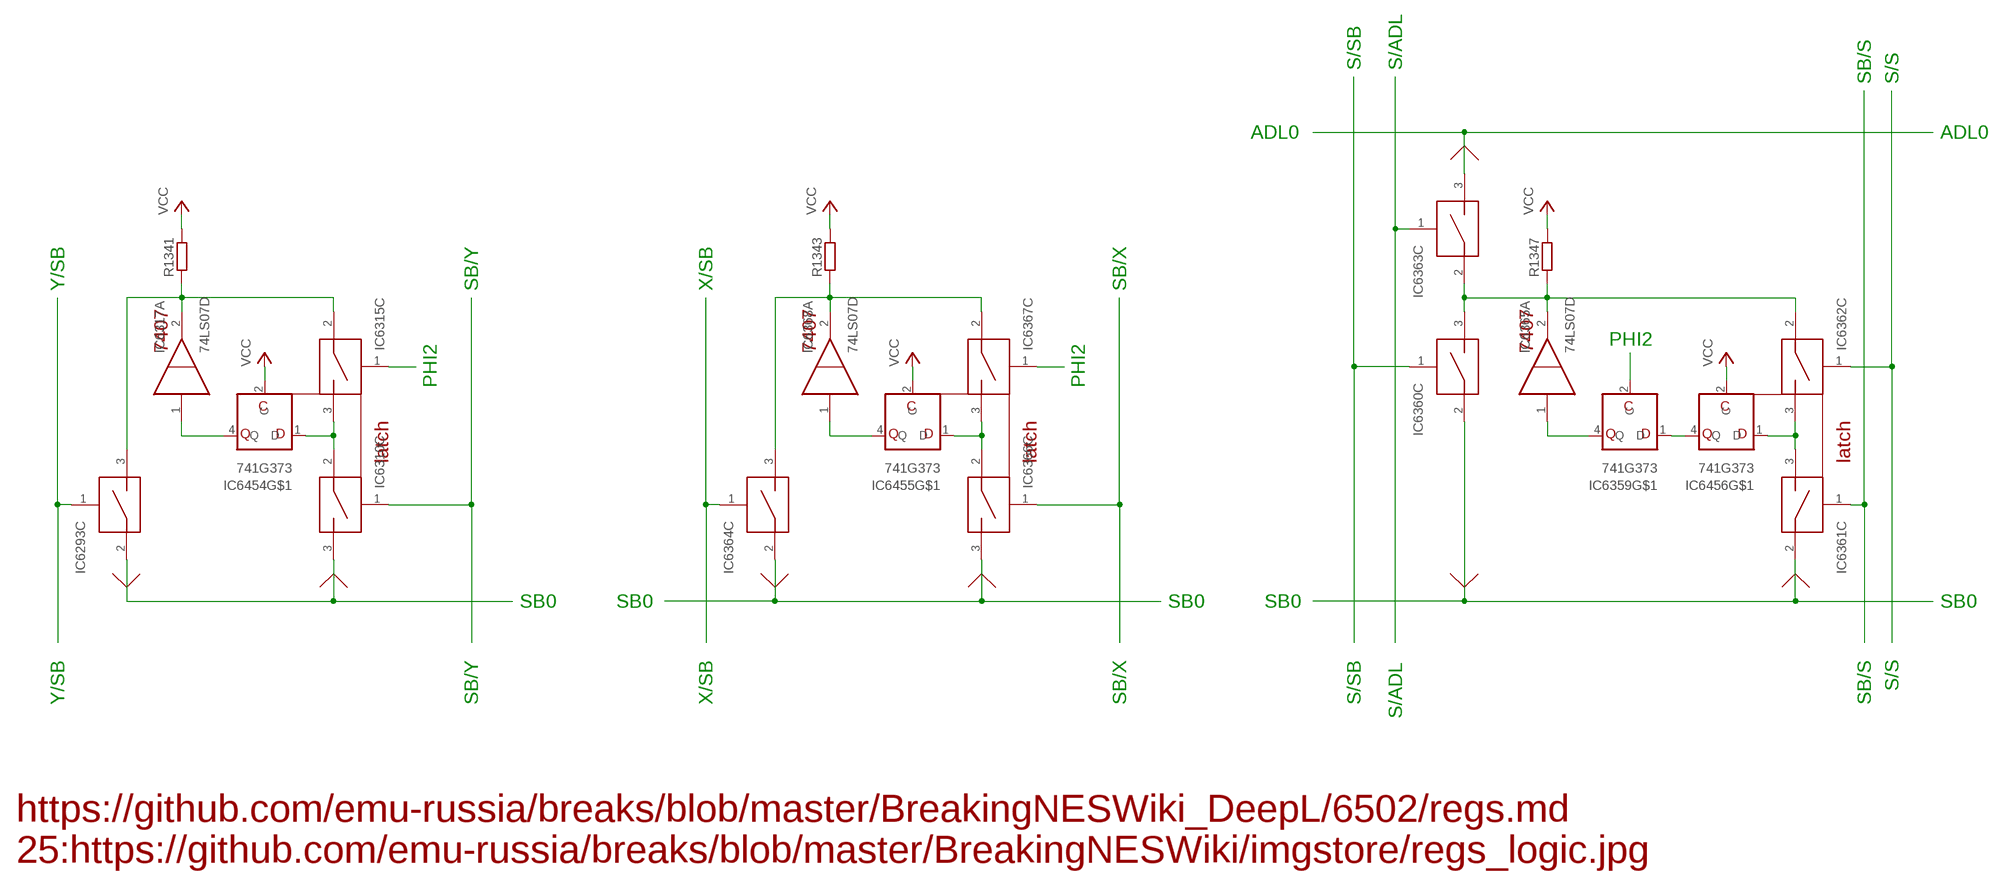
[diagram p34: schematic, sheet 26]

### Parts
IC6293  MAX4613SO16  [SO16]
IC6310  MAX4613SO16  [SO16]
IC6315  MAX4613SO16  [SO16]
IC6317  74LS07D  [SO14]
IC6359  741G373  [DBV-R-PDSO-G5]
IC6360  MAX4613SO16  [SO16]
IC6361  MAX4613SO16  [SO16]
IC6362  MAX4613SO16  [SO16]
IC6363  MAX4613SO16  [SO16]
IC6364  MAX4613SO16  [SO16]
IC6365  74LS07D  [SO14]
IC6366  MAX4613SO16  [SO16]
IC6367  MAX4613SO16  [SO16]
IC6368  74LS07D  [SO14]
IC6454  741G373  [DBV-R-PDSO-G5]
IC6455  741G373  [DBV-R-PDSO-G5]
IC6456  741G373  [DBV-R-PDSO-G5]
R1341  R-EU_R0603  [R0603]
R1343  R-EU_R0603  [R0603]
R1347  R-EU_R0603  [R0603]

### Nets
N$11466: IC6317.1(A:I) IC6454.4(Q)
N$11467: IC6293.3 IC6315.2 IC6317.2(A:O) R1341.1
N$11468: IC6293.2 IC6310.3
N$11503: IC6315.1
N$11504: IC6293.1
N$11505: IC6310.1
N$11514: IC6359.2(C)
N$11516: IC6360.2 IC6361.2
N$11517: IC6366.2 IC6367.3 IC6455.1(D)
N$11518: IC6360.1
N$11519: IC6361.1
N$11520: IC6363.3
N$11521: IC6362.1
N$11522: IC6361.3 IC6362.3 IC6456.1(D)
N$11574: IC6363.1
N$11575: IC6364.3 IC6367.2 IC6368.2(A:O) R1343.1
N$11576: IC6360.3 IC6362.2 IC6363.2 IC6365.2(A:O) R1347.1
N$11577: IC6359.4(Q) IC6365.1(A:I)
N$11578: IC6364.2 IC6366.3
N$11579: IC6367.1
N$11580: IC6364.1
N$11581: IC6366.1
N$11617: IC6310.2 IC6315.3 IC6454.1(D)
N$11618: IC6368.1(A:I) IC6455.4(Q)
N$11619: IC6359.1(D) IC6456.4(Q)
VCC: IC6454.2(C) IC6455.2(C) IC6456.2(C) R1341.2 R1343.2 R1347.2 ; also sheet 1,2,3,4,9,11,12,13,19,20,21,22,23
Unconnected: IC6293.4(PWR:V-) IC6293.5(PWR:GND) IC6293.6 IC6293.7 IC6293.8 IC6293.9 IC6293.10 IC6293.11 IC6293.12(PWR:VCC) IC6293.13(PWR:V+) IC6293.14 IC6293.15 IC6293.16 IC6310.4(PWR:V-) IC6310.5(PWR:GND) IC6310.6 IC6310.7 IC6310.8 IC6310.9 IC6310.10 IC6310.11 IC6310.12(PWR:VCC) IC6310.13(PWR:V+) IC6310.14 IC6310.15 IC6310.16 IC6315.4(PWR:V-) IC6315.5(PWR:GND) IC6315.6 IC6315.7 IC6315.8 IC6315.9 IC6315.10 IC6315.11 IC6315.12(PWR:VCC) IC6315.13(PWR:V+) IC6315.14 IC6315.15 IC6315.16 IC6317.3(B:I) IC6317.4(B:O) IC6317.5(C:I) IC6317.6(C:O) IC6317.8(D:O) IC6317.9(D:I) IC6317.10(E:O) IC6317.11(E:I) IC6317.12(F:O) IC6317.13(F:I) IC6360.4(PWR:V-) IC6360.5(PWR:GND) IC6360.6 IC6360.7 IC6360.8 IC6360.9 IC6360.10 IC6360.11 IC6360.12(PWR:VCC) IC6360.13(PWR:V+) IC6360.14 IC6360.15 IC6360.16 IC6361.4(PWR:V-) IC6361.5(PWR:GND) IC6361.6 IC6361.7 IC6361.8 IC6361.9 IC6361.10 IC6361.11 IC6361.12(PWR:VCC) IC6361.13(PWR:V+) IC6361.14 IC6361.15 IC6361.16 IC6362.4(PWR:V-) IC6362.5(PWR:GND) IC6362.6 IC6362.7 IC6362.8 IC6362.9 IC6362.10 IC6362.11 IC6362.12(PWR:VCC) IC6362.13(PWR:V+) IC6362.14 IC6362.15 IC6362.16 IC6363.4(PWR:V-) IC6363.5(PWR:GND) IC6363.6 IC6363.7 IC6363.8 IC6363.9 IC6363.10 IC6363.11 IC6363.12(PWR:VCC) IC6363.13(PWR:V+) IC6363.14 IC6363.15 IC6363.16 IC6364.4(PWR:V-) IC6364.5(PWR:GND) IC6364.6 IC6364.7 IC6364.8 IC6364.9 IC6364.10 IC6364.11 IC6364.12(PWR:VCC) IC6364.13(PWR:V+) IC6364.14 IC6364.15 IC6364.16 IC6365.3(B:I) IC6365.4(B:O) IC6365.5(C:I) IC6365.6(C:O) IC6365.8(D:O) IC6365.9(D:I) IC6365.10(E:O) IC6365.11(E:I) IC6365.12(F:O) IC6365.13(F:I) IC6366.4(PWR:V-) IC6366.5(PWR:GND) IC6366.6 IC6366.7 IC6366.8 IC6366.9 IC6366.10 IC6366.11 IC6366.12(PWR:VCC) IC6366.13(PWR:V+) IC6366.14 IC6366.15 IC6366.16 IC6367.4(PWR:V-) IC6367.5(PWR:GND) IC6367.6 IC6367.7 IC6367.8 IC6367.9 IC6367.10 IC6367.11 IC6367.12(PWR:VCC) IC6367.13(PWR:V+) IC6367.14 IC6367.15 IC6367.16 IC6368.3(B:I) IC6368.4(B:O) IC6368.5(C:I) IC6368.6(C:O) IC6368.8(D:O) IC6368.9(D:I) IC6368.10(E:O) IC6368.11(E:I) IC6368.12(F:O) IC6368.13(F:I)

### Notes on the sheet
- S/SB | S/ADL
- SB/S | S/S
- ADL0 | ADL0
- Y/SB | SB/Y | X/SB | SB/X
- PHI2
- 7407 | 7407 | 7407
- PHI2 | PHI2
- latch | latch | latch
- SB0 | SB0 | SB0 | SB0 | SB0
- S/S
- Y/SB | SB/Y | X/SB | SB/X | S/SB | SB/S
- S/ADL
- https://github.com/emu-russia/breaks/blob/master/BreakingNESWiki_DeepL/6502/regs.md
  25:https://github.com/emu-russia/breaks/blob/master/BreakingNESWiki/imgstore/regs_logic.jpg